# EAGLE board control (EAGLE 9.3.2), part 1 of 2
VERSION: v3.0
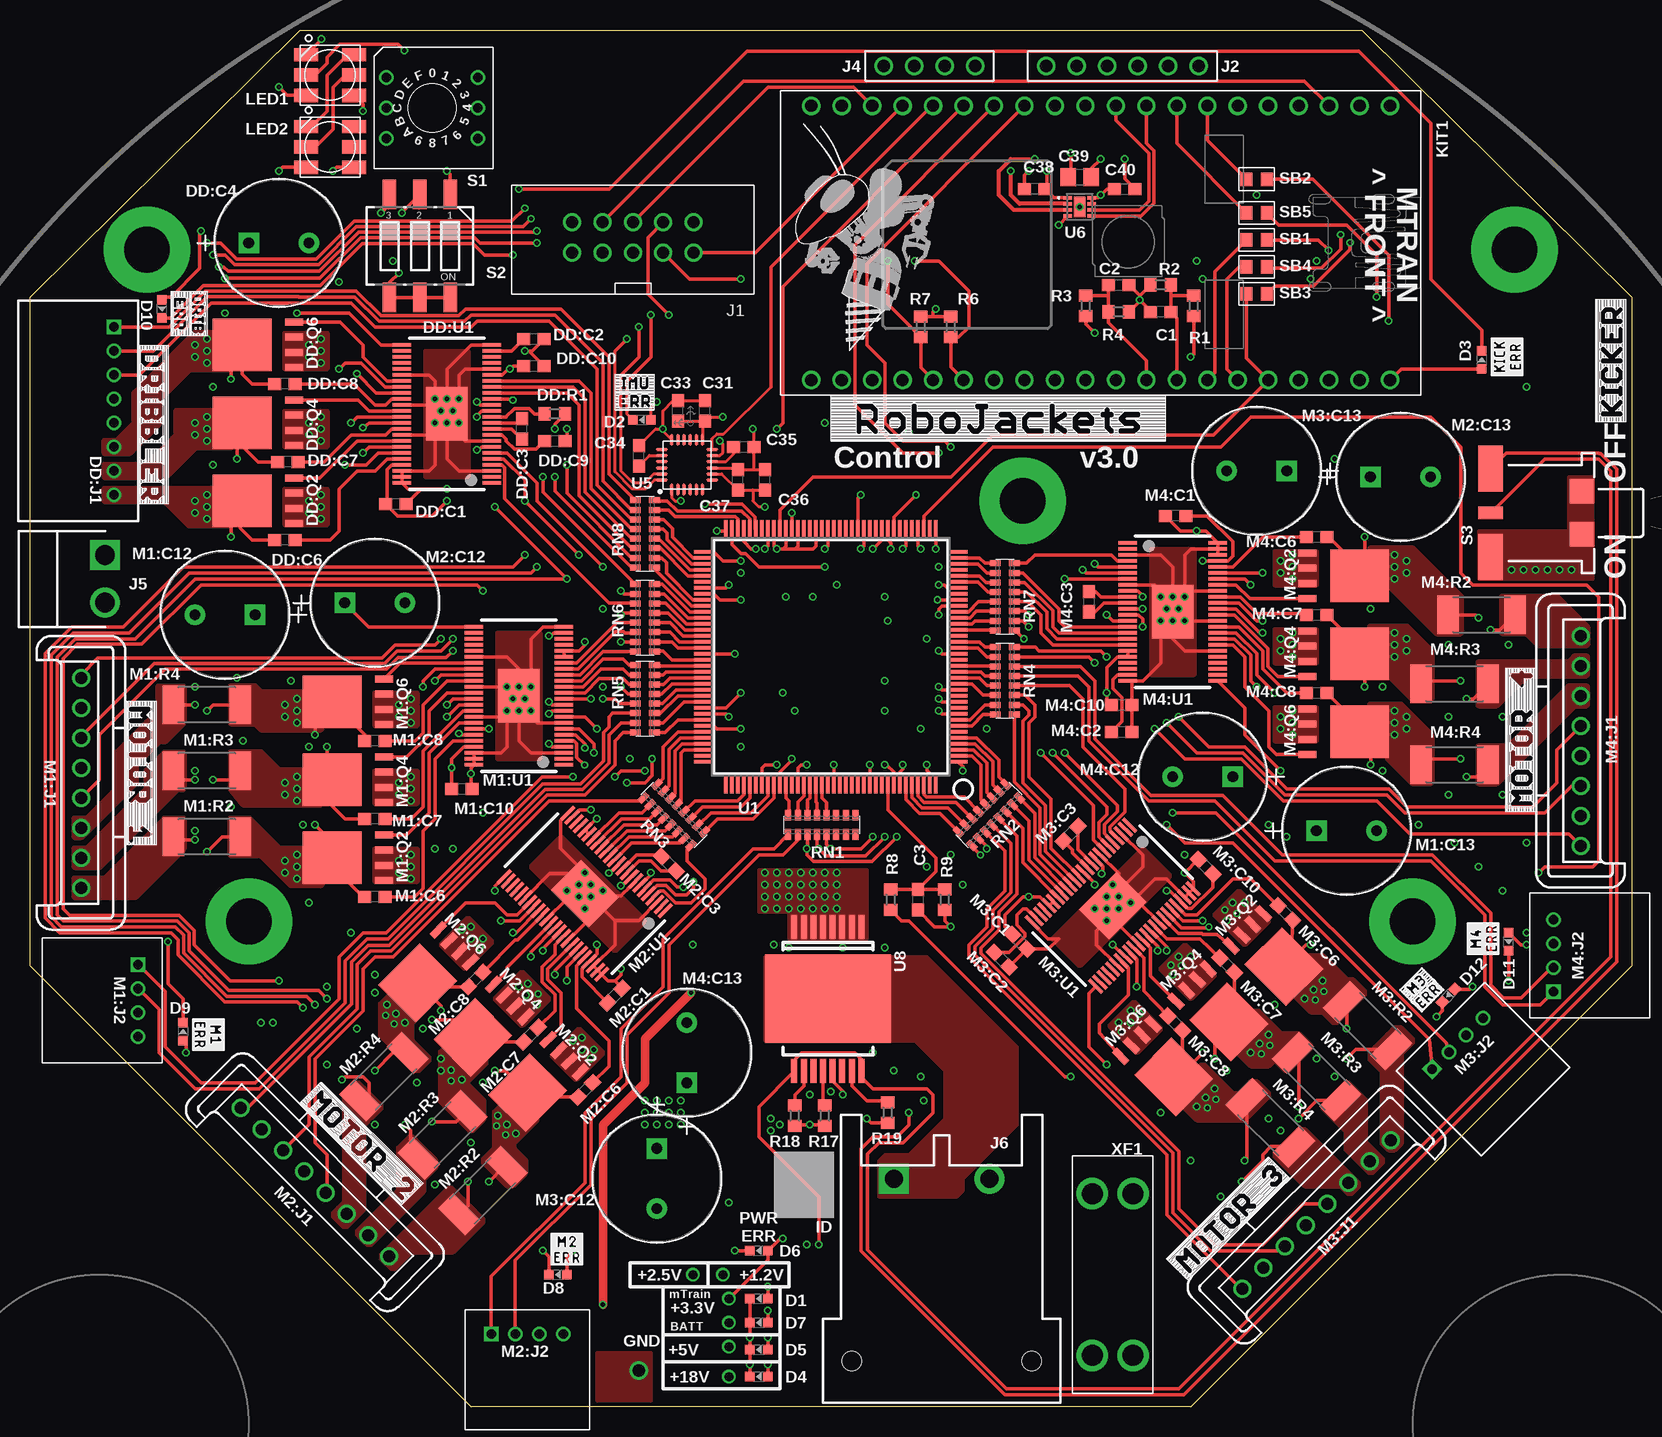
[diagram p8: board, top side]
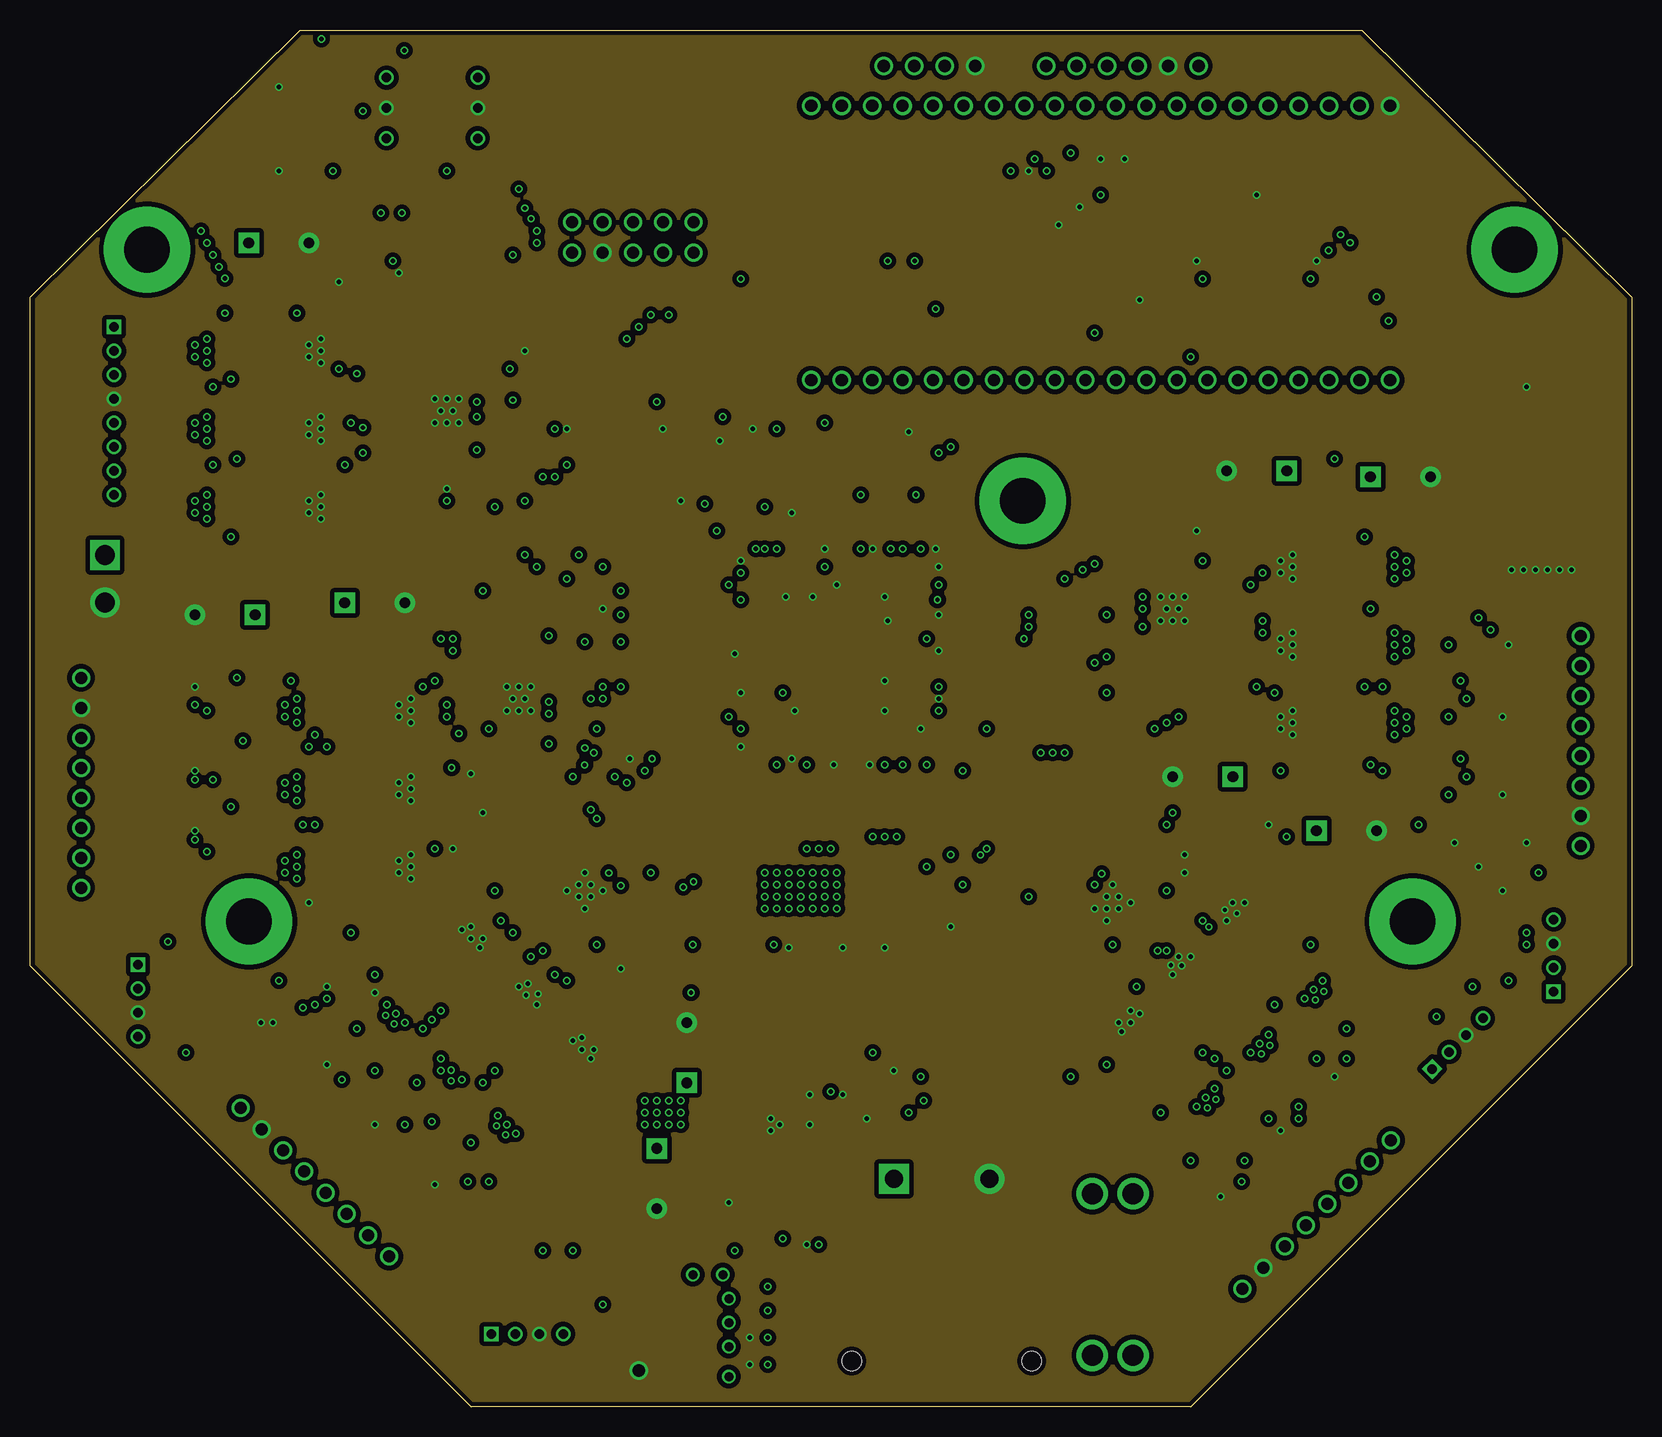
[diagram p9: board, inner layer GND]
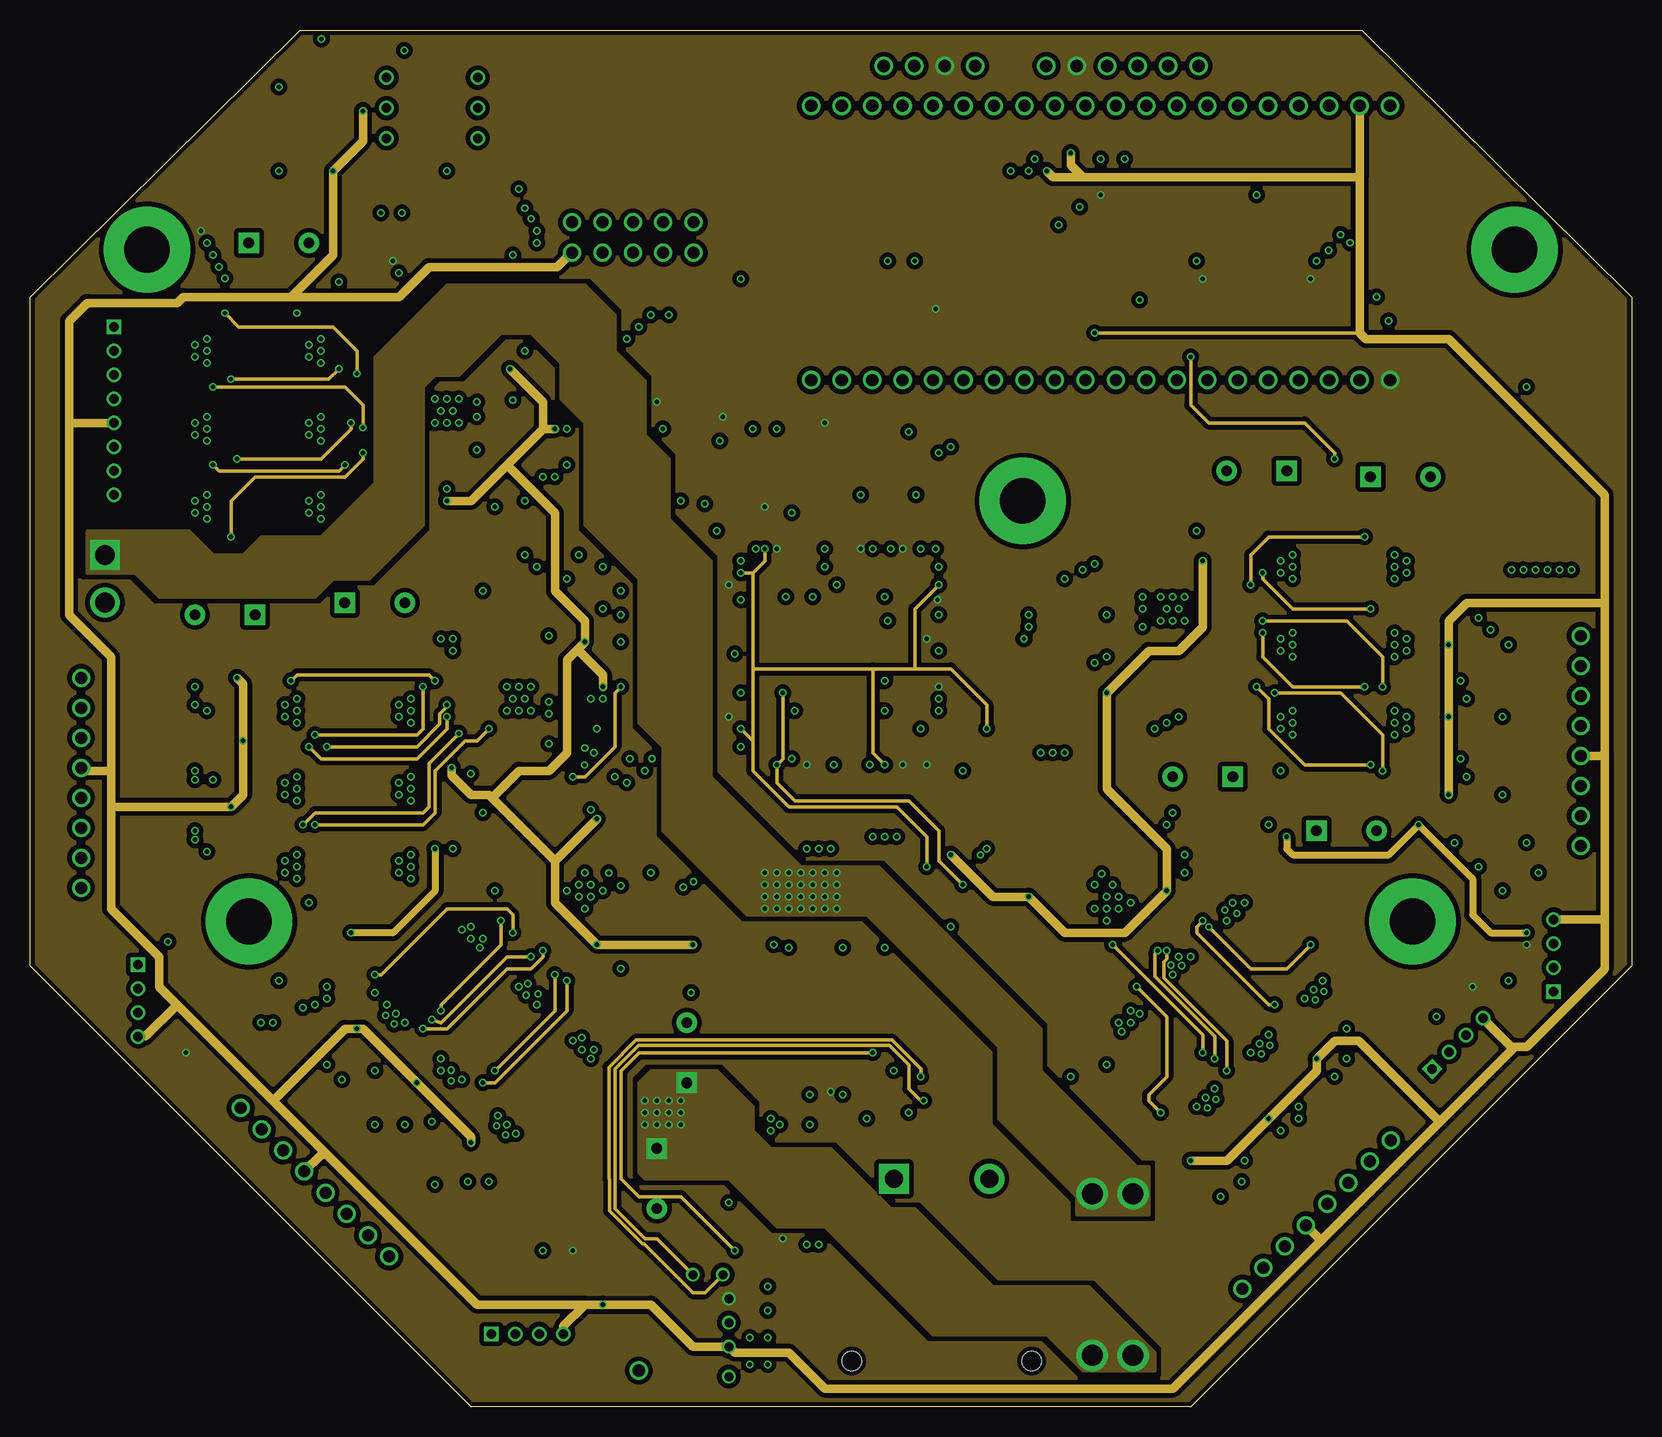
[diagram p10: board, inner layer Power]
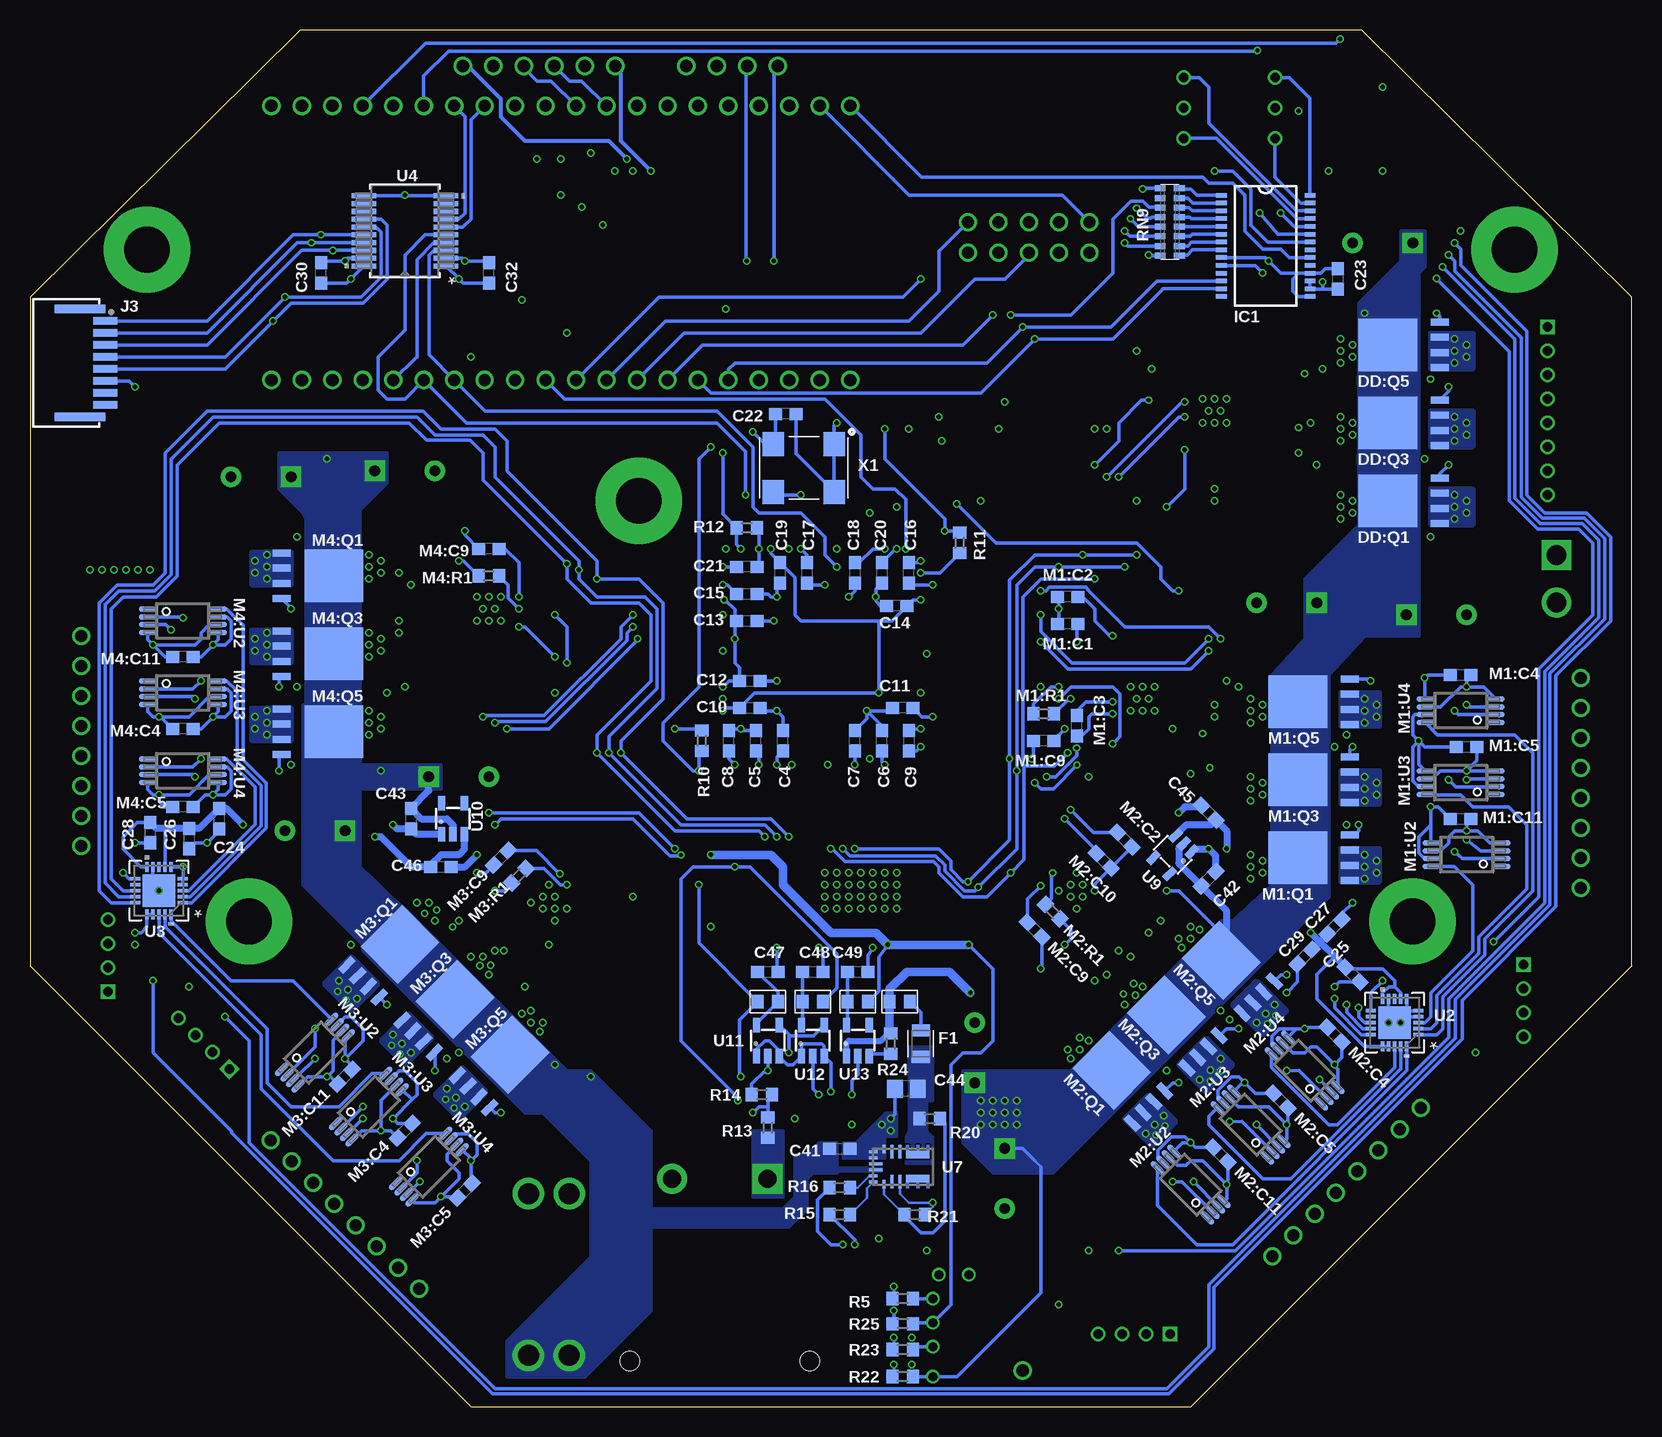
[diagram p11: board, bottom side, seen from below]

Size 133.5 x 114.75 mm. Coordinates in mm from the lower left corner, seen from the top.
Outline: 96.75,0 36.75,0 0,36.75 0,92.5 22.5,114.75 111,114.75 133.5,92.5 133.5,36.75 96.75,0
Copper layers (1+2*3+16): Top 0.018mm / dielectric 0.36mm / GND 0.035mm / dielectric 0.71mm / Power 0.035mm / dielectric 0.36mm / Bottom 0.018mm
Design rules "eC_4Layer_PClass6_BaseCopperO18-I35_eCDefault": minimum track width 0.15mm, minimum drill 0.35mm, track to track 0.15mm, track to pad 0.15mm, pad to pad 0.15mm, via to via 0.15mm, smd to smd 0mil, copper to edge 0.25mm, drill to drill 0.35mm, minimum pad ring 0.175mm, minimum via ring 0.125mm, stop-mask expansion 0mil, vias tented up to drill 0.45mm, thermal gap 0.2mm

## Footprints (pad centres in the part's own frame; a part is rotated, then mirrored left to right if it is on the bottom)
C0603 = smd 1.1 x 1: 1 -0.85,0; 2 0.85,0
C0805 = smd 1.3 x 1.5: 1 -0.95,0; 2 0.95,0
CHIP-LED0603 = smd 0.8 x 0.8: A 0,-0.75; C 0,0.75
CAP_PAN_10X12.5 = drill 0.914 pad 1.676 square: 1 -5.004,0 | drill 0.914 pad 1.676: 2 0,0
2MM-8-H = drill 0.8 square: 1 -7,0 | drill 0.8: 2 -5,0; 3 -3,0; 4 -1,0; 5 1,0; 6 3,0; 7 5,0; 8 7,0
PQFN_5X6_E = smd 1.5 x 0.6: 1 -3.02,1.905; 2 -3.02,0.635; 3 -3.02,-0.635; 4 -3.02,-1.905 | smd 4.895 x 4.41: 5678 1.323,0
R0603 = smd 1 x 1.1: 1 -0.85,0; 2 0.85,0
TSSOP-48_PAD = smd 0.3 x 1.55: 1 -5.75,-3.75; 2 -5.25,-3.75; 3 -4.75,-3.75; 4 -4.25,-3.75; 5 -3.75,-3.75; 6 -3.25,-3.75; 7 -2.75,-3.75; 8 -2.25,-3.75; 9 -1.75,-3.75; 10 -1.25,-3.75; 11 -0.75,-3.75; 12 -0.25,-3.75; 13 0.25,-3.75; 14 0.75,-3.75; 15 1.25,-3.75; 16 1.75,-3.75; 17 2.25,-3.75; 18 2.75,-3.75; 19 3.25,-3.75; 20 3.75,-3.75; 21 4.25,-3.75; 22 4.75,-3.75; 23 5.25,-3.75; 24 5.75,-3.75; 25 5.75,3.75; 26 5.25,3.75; 27 4.75,3.75; 28 4.25,3.75; 29 3.75,3.75; 30 3.25,3.75; 31 2.75,3.75; 32 2.25,3.75; 33 1.75,3.75; 34 1.25,3.75; 35 0.75,3.75; 36 0.25,3.75; 37 -0.25,3.75; 38 -0.75,3.75; 39 -1.25,3.75; 40 -1.75,3.75; 41 -2.25,3.75; 42 -2.75,3.75; 43 -3.25,3.75; 44 -3.75,3.75; 45 -4.25,3.75; 46 -4.75,3.75; 47 -5.25,3.75; 48 -5.75,3.75 | smd 4.42 x 3.483: PAD 0,0
FUSC2113X75 = smd 1 x 1.52: 1 -1.1,0 | smd 1 x 1.5: 2 1.1,0
SSOP-28 = smd 0.9 x 0.38: 1 -3.7,4.225; 2 -3.7,3.575; 3 -3.7,2.925; 4 -3.7,2.275; 5 -3.7,1.625; 6 -3.7,0.975; 7 -3.7,0.325; 8 -3.7,-0.325; 9 -3.7,-0.975; 10 -3.7,-1.625; 11 -3.7,-2.275; 12 -3.7,-2.925; 13 -3.7,-3.575; 14 -3.7,-4.225; 15 3.7,-4.225; 16 3.7,-3.575; 17 3.7,-2.925; 18 3.7,-2.275; 19 3.7,-1.625; 20 3.7,-0.975; 21 3.7,-0.325; 22 3.7,0.325; 23 3.7,0.975; 24 3.7,1.625; 25 3.7,2.275; 26 3.7,2.925; 27 3.7,3.575; 28 3.7,4.225
SBH11-*-D05-RA-VERT = drill 1: 1 -5.08,-1.27; 2 -2.54,-1.27; 3 0,-1.27; 4 2.54,-1.27; 5 5.08,-1.27; 6 5.08,1.27; 7 2.54,1.27; 8 0,1.27; 9 -2.54,1.27; 10 -5.08,1.27
6-PIN-HEADER = drill 1.02: 1 -2.54,0; 2 0,0; 3 2.54,0; 4 5.08,0; 5 7.62,0; 6 10.16,0
HFW8R-1ST = smd 0.6 x 2: 1 -3.5,3.25; 2 -2.5,3.25; 3 -1.5,3.25; 4 -0.5,3.25; 5 0.5,3.25; 6 1.5,3.25; 7 2.5,3.25; 8 3.5,3.25 | smd 0.7 x 4.2: LEG1 -4.5,1.15; LEG2 4.5,1.15
4-PIN-HEADER = drill 1.02: 1 -2.54,0; 2 0,0; 3 2.54,0; 4 5.08,0
B2PS-CENTERED = drill 1.65 square: 1 -1.98,0 | drill 1.65: 2 1.98,0
DF22-2-H = drill 1.5 pad 2.5 square: 1 3.96,0 | drill 1.5 pad 2.5: 2 -3.96,0 | hole 1.6: -7.5,15.2; 7.5,15.2
MTRAIN-KIT = drill 1.02: !RST 11.43,16.51; GND -11.43,24.13; NC 11.43,19.05; P$3 -11.43,19.05; P$4 -11.43,16.51; P$5 -11.43,13.97; P$6 -11.43,11.43; P$7 -11.43,8.89; P$8 -11.43,6.35; P$9 -11.43,3.81; P$10 -11.43,1.27; P$11 -11.43,-1.27; P$12 -11.43,-3.81; P$13 -11.43,-6.35; P$14 -11.43,-8.89; P$15 -11.43,-11.43; P$16 -11.43,-13.97; P$17 -11.43,-16.51; P$18 -11.43,-19.05; P$19 -11.43,-21.59; P$20 -11.43,-24.13; P$25 11.43,-13.97; P$26 11.43,-11.43; P$27 11.43,-8.89; P$28 11.43,-6.35; P$29 11.43,-3.81; P$30 11.43,-1.27; P$31 11.43,1.27; P$32 11.43,3.81; P$33 11.43,6.35; P$34 11.43,8.89; P$35 11.43,11.43; P$36 11.43,13.97; RX+ 11.43,-16.51; RX- 11.43,-19.05; TX+ 11.43,-21.59; TX- 11.43,-24.13; VBUS 11.43,21.59; VDD 11.43,24.13; VIN -11.43,21.59
APA102_5050 = smd 2 x 1.1: 1 2,-1.7; 2 2,0; 3 2,1.7; 4 -2,1.7; 5 -2,0; 6 -2,-1.7
MKS-1658 = drill 1 pad 1.422: 1 -8.75,0; 2 -6.25,0; 3 -3.75,0; 4 -1.25,0; 5 1.25,0; 6 3.75,0; 7 6.25,0; 8 8.75,0
2MM-4-H = drill 0.8 square: 1 -3,0 | drill 0.8: 2 -1,0; 3 1,0; 4 3,0
R2512 = smd 1.8 x 3.2: 1 -2.8,0; 2 2.8,0
PW0008A_N = smd 1.4 x 0.45: 1 -2.95,0.975; 2 -2.95,0.325; 3 -2.95,-0.325; 4 -2.95,-0.975; 5 2.95,-0.975; 6 2.95,-0.325; 7 2.95,0.325; 8 2.95,0.975
RA-8_2506 = smd 0.5 x 0.9: 1 -2.8,-0.8; 2 -2,-0.8; 3 -1.2,-0.8; 4 -0.4,-0.8; 5 0.4,-0.8; 6 1.2,-0.8; 7 2,-0.8; 8 2.8,-0.8; 9 2.8,0.8; 10 2,0.8; 11 1.2,0.8; 12 0.4,0.8; 13 -0.4,0.8; 14 -1.2,0.8; 15 -2,0.8; 16 -2.8,0.8
HEX = drill 0.8: 1 -2.54,-2.54; 2 2.54,5.08; 4 2.54,-2.54; 8 -2.54,5.08; C1 0,-2.54; C2 0,5.08
CTS-219-03 = smd 1.13 x 2.44: 1 -2.54,-4.3; 2 0,-4.3; 3 2.54,-4.3; 4 2.54,4.3; 5 0,4.3; 6 -2.54,4.3
34EWMSP12M6RT = smd 3.81 x 2.03: 1 -3.685,0; 3 3.685,0 | smd 1.02 x 2.03: 2 0,0 | smd 2.03 x 2.03: LEG1 -1.78,7.62; LEG3 1.78,7.62
SB0603 = smd 1 x 1.1: 1 -0.85,0; 2 0.85,0
TQFP144 = smd 0.3 x 1.6: 1 -8.75,-10.6; 2 -8.25,-10.6; 3 -7.75,-10.6; 4 -7.25,-10.6; 5 -6.75,-10.6; 6 -6.25,-10.6; 7 -5.75,-10.6; 8 -5.25,-10.6; 9 -4.75,-10.6; 10 -4.25,-10.6; 11 -3.75,-10.6; 12 -3.25,-10.6; 13 -2.75,-10.6; 14 -2.25,-10.6; 15 -1.75,-10.6; 16 -1.25,-10.6; 17 -0.75,-10.6; 18 -0.25,-10.6; 19 0.25,-10.6; 20 0.75,-10.6; 21 1.25,-10.6; 22 1.75,-10.6; 23 2.25,-10.6; 24 2.75,-10.6; 25 3.25,-10.6; 26 3.75,-10.6; 27 4.25,-10.6; 28 4.75,-10.6; 29 5.25,-10.6; 30 5.75,-10.6; 31 6.25,-10.6; 32 6.75,-10.6; 33 7.25,-10.6; 34 7.75,-10.6; 35 8.25,-10.6; 36 8.75,-10.6; 73 8.75,10.6; 74 8.25,10.6; 75 7.75,10.6; 76 7.25,10.6; 77 6.75,10.6; 78 6.25,10.6; 79 5.75,10.6; 80 5.25,10.6; 81 4.75,10.6; 82 4.25,10.6; 83 3.75,10.6; 84 3.25,10.6; 85 2.75,10.6; 86 2.25,10.6; 87 1.75,10.6; 88 1.25,10.6; 89 0.75,10.6; 90 0.25,10.6; 91 -0.25,10.6; 92 -0.75,10.6; 93 -1.25,10.6; 94 -1.75,10.6; 95 -2.25,10.6; 96 -2.75,10.6; 97 -3.25,10.6; 98 -3.75,10.6; 99 -4.25,10.6; 100 -4.75,10.6; 101 -5.25,10.6; 102 -5.75,10.6; 103 -6.25,10.6; 104 -6.75,10.6; 105 -7.25,10.6; 106 -7.75,10.6; 107 -8.25,10.6; 108 -8.75,10.6 | smd 1.6 x 0.3: 37 10.6,-8.75; 38 10.6,-8.25; 39 10.6,-7.75; 40 10.6,-7.25; 41 10.6,-6.75; 42 10.6,-6.25; 43 10.6,-5.75; 44 10.6,-5.25; 45 10.6,-4.75; 46 10.6,-4.25; 47 10.6,-3.75; 48 10.6,-3.25; 49 10.6,-2.75; 50 10.6,-2.25; 51 10.6,-1.75; 52 10.6,-1.25; 53 10.6,-0.75; 54 10.6,-0.25; 55 10.6,0.25; 56 10.6,0.75; 57 10.6,1.25; 58 10.6,1.75; 59 10.6,2.25; 60 10.6,2.75; 61 10.6,3.25; 62 10.6,3.75; 63 10.6,4.25; 64 10.6,4.75; 65 10.6,5.25; 66 10.6,5.75; 67 10.6,6.25; 68 10.6,6.75; 69 10.6,7.25; 70 10.6,7.75; 71 10.6,8.25; 72 10.6,8.75; 109 -10.6,8.75; 110 -10.6,8.25; 111 -10.6,7.75; 112 -10.6,7.25; 113 -10.6,6.75; 114 -10.6,6.25; 115 -10.6,5.75; 116 -10.6,5.25; 117 -10.6,4.75; 118 -10.6,4.25; 119 -10.6,3.75; 120 -10.6,3.25; 121 -10.6,2.75; 122 -10.6,2.25; 123 -10.6,1.75; 124 -10.6,1.25; 125 -10.6,0.75; 126 -10.6,0.25; 127 -10.6,-0.25; 128 -10.6,-0.75; 129 -10.6,-1.25; 130 -10.6,-1.75; 131 -10.6,-2.25; 132 -10.6,-2.75; 133 -10.6,-3.25; 134 -10.6,-3.75; 135 -10.6,-4.25; 136 -10.6,-4.75; 137 -10.6,-5.25; 138 -10.6,-5.75; 139 -10.6,-6.25; 140 -10.6,-6.75; 141 -10.6,-7.25; 142 -10.6,-7.75; 143 -10.6,-8.25; 144 -10.6,-8.75
RTJ20_2P7X2P7 = smd 0.85 x 0.28: 1 -1.975,1; 2 -1.975,0.5; 3 -1.975,0; 4 -1.975,-0.5; 5 -1.975,-1; 11 1.975,-1; 12 1.975,-0.5; 13 1.975,0; 14 1.975,0.5; 15 1.975,1 | smd 0.28 x 0.85: 6 -1,-1.975; 7 -0.5,-1.975; 8 0,-1.975; 9 0.5,-1.975; 10 1,-1.975; 16 1,1.975; 17 0.5,1.975; 18 0,1.975; 19 -0.5,1.975; 20 -1,1.975 | smd 2.7 x 2.7: 21 0,0
RS_20 = smd 2.057 x 0.432: 1 -3.429,2.925; 2 -3.429,2.275; 3 -3.429,1.625; 4 -3.429,0.975; 5 -3.429,0.325; 6 -3.429,-0.325; 7 -3.429,-0.975; 8 -3.429,-1.625; 9 -3.429,-2.275; 10 -3.429,-2.925; 11 3.429,-2.925; 12 3.429,-2.275; 13 3.429,-1.625; 14 3.429,-0.975; 15 3.429,-0.325; 16 3.429,0.325; 17 3.429,0.975; 18 3.429,1.625; 19 3.429,2.275; 20 3.429,2.925
QFN-24-4MM2 = smd 1.016 x 0.254: 1 -2.066,1.257; 2 -2.066,0.75; 3 -2.066,0.247; 4 -2.066,-0.287; 5 -2.066,-0.792; 6 -2.066,-1.297; 13 2.086,-1.297; 14 2.086,-0.792; 15 2.086,-0.287; 16 2.086,0.247; 17 2.086,0.75; 18 2.086,1.257 | smd 0.254 x 1.016: 7 -1.267,-2.122; 8 -0.762,-2.122; 9 -0.258,-2.122; 10 0.278,-2.122; 11 0.78,-2.122; 12 1.287,-2.122; 19 1.287,2.082; 20 0.78,2.082; 21 0.278,2.082; 22 -0.258,2.082; 23 -0.762,2.082; 24 -1.267,2.082
DSG_8 = smd 0.711 x 0.305: 1 -1.003,0.762; 2 -1.003,0.254; 3 -1.003,-0.254; 4 -1.003,-0.762; 5 1.003,-0.762; 6 1.003,-0.254; 7 1.003,0.254; 8 1.003,0.762 | smd 0.965 x 1.702: 9 0,0
MPM3620GQV-P = smd 0.7 x 0.25: 1 -1.45,1.55; 12 1.45,1.55 | smd 1.1 x 0.25: 2 -1.25,0.9; 3 -1.25,0.25; 10 1.25,0.25; 11 1.25,0.9 | smd 0.25 x 0.7: 13 1.25,2.45; 14 0.75,2.45; 17 -0.75,2.45; 18 -1.25,2.45 | smd 0.25 x 1.1: 15 0.25,2.25; 16 -0.25,2.25 | smd 0.6 x 1.95: 456 -1,-1.25; 789 1,-1.25
POWERSO-16 = smd 0.5 x 2: 1 -2.8,-6; 2 -2,-6; 3 -1.2,-6; 4 -0.4,-6; 5 0.4,-6; 6 1.2,-6; 7 2,-6; 8 2.8,-6; 9 2.8,6; 10 2,6; 11 1.2,6; 12 0.4,6; 13 -0.4,6; 14 -1.2,6; 15 -2,6; 16 -2.8,6 | smd 10.5 x 7.4: 17 0,0
SOT-23-5 = smd 0.6 x 1.2: 1 -0.95,-1.306; 2 0,-1.306; 3 0.95,-1.306; 4 0.95,1.306; 5 -0.95,1.306
ASV = smd 1.8 x 2: 1 -2.54,-2; 2 2.54,-2; 3 2.54,2; 4 -2.54,2
3557-2 = drill 1.75: 1 -6.735,1.7; 2 -6.735,-1.7; 3 6.735,-1.7; 4 6.735,1.7

## Placement (x,y rotation side)
C1  0.1uF 50V  [C0603]  94.25,91.25 180 top
C2  0.1uF  [C0603]  90.75,93.5 0 top
C3  0.1uF  [C0603]  74,42.25 270 top
C4  0.1uF  [C0603]  70.75,55.5 90 bottom
C5  0.1uF  [C0603]  73,55.5 90 bottom
C6  0.1uF  [C0603]  62.5,55.5 90 bottom
C7  0.1uF  [C0603]  64.75,55.5 90 bottom
C8  0.1uF  [C0603]  75.25,55.5 90 bottom
C9  0.1uF  [C0603]  60.25,55.5 270 bottom
C10  0.1uF  [C0603]  73.5,58.25 0 bottom
C11  0.1uF  [C0603]  60.75,58.25 180 bottom
C12  0.1uF  [C0603]  73.5,60.5 0 bottom
C13  0.1uF  [C0603]  73.75,65.5 0 bottom
C14  0.1uF  [C0603]  61.25,66.75 180 bottom
C15  0.1uF  [C0603]  73.75,67.75 0 bottom
C16  0.1uF  [C0603]  60.25,69.5 90 bottom
C17  0.1uF  [C0603]  68.75,69.5 270 bottom
C18  0.1uF  [C0603]  64.75,69.5 270 bottom
C19  0.1uF  [C0603]  71,69.5 270 bottom
C20  0.1uF  [C0603]  62.5,69.5 270 bottom
C21  0.1uF  [C0603]  73.75,70 180 bottom
C22  0.1uF  [C0603]  70.5,82.75 180 bottom
C23  0.1uF  [C0603]  24.5,94 270 bottom
C24  10uF  [C0603]  117.75,49 270 bottom
C25  10uF  [C0603]  23.25,36 315 bottom
C26  0.1uF  [C0603]  120.25,47.35 270 bottom
C27  0.1uF  [C0603]  24.75,40 45 bottom
C28  0.1uF  [C0603]  123.5,47.85 270 bottom
C29  0.1uF  [C0603]  27.25,37.5 225 bottom
C30  0.1uF  [C0603]  109.25,94.5 90 bottom
C31  0.47uF  [C0603]  56.25,83 90 top
C32  0.1uF  [C0603]  95.25,94.5 90 bottom
C33  0.47uF  [C0603]  54,83 90 top
C34  2200pF  [C0603]  50.75,79.25 90 top
C35  0.1uF  [C0603]  59.5,80 0 top
C36  10000pF  [C0603]  61.25,77.25 90 top
C37  0.47uF  [C0603]  59,77.25 90 top
C38  0.1uF  [C0603]  83.75,101.5 180 top
C39  10uF  [C0805]  87.5,102.5 0 top
C40  0.1uF  [C0603]  91.25,101.5 0 top
C41  GRM188R6YA106MA73D  [C0603]  66,21.5 0 bottom
C42  0.1uF 50V  [C0603]  35.25,44 45 bottom
C43  0.1uF 50V  [C0603]  101.75,49 270 bottom
C44  22uF 16V  [C0805]  60.45,26.5 180 bottom
C45  1uF  [C0603]  35.25,49.5 135 bottom
C46  1uF  [C0603]  99.25,45 0 bottom
C47  1uF  [C0603]  72,36.25 0 bottom
C48  1uF  [C0603]  68.25,36.25 0 bottom
C49  1uF  [C0603]  64.5,36.25 0 bottom
D1  GREEN  [CHIP-LED0603]  60.75,9 90 top
D2  RED  [CHIP-LED0603]  51,82.25 90 top
D3  RED  [CHIP-LED0603]  121,87.25 0 top
D4  GREEN  [CHIP-LED0603]  60.75,2.5 90 top
D5  GREEN  [CHIP-LED0603]  60.75,4.75 90 top
D6  RED  [CHIP-LED0603]  60.75,13 90 top
D7  GREEN  [CHIP-LED0603]  60.75,7 90 top
D8  RED  [CHIP-LED0603]  44,11 90 top
D9  RED  [CHIP-LED0603]  12.75,31.25 0 top
D10  RED  [CHIP-LED0603]  11,91.5 180 top
D11  RED  [CHIP-LED0603]  123.25,38.75 180 top
D12  RED  [CHIP-LED0603]  118.25,34.25 136 top
DD:C1  1uF  [C0603]  30.5,75.25 0 top
DD:C2  1uF  [C0603]  42,89 0 top
DD:C3  0.022uF 50V  [C0603]  41,81.5 90 top
DD:C4  ECA-1HHG221  [CAP_PAN_10X12.5]  23.25,97 0 top
DD:C6  0.1uF 50V  [C0603]  21.25,72.25 180 top
DD:C7  0.1uF 50V  [C0603]  21.5,78.75 180 top
DD:C8  0.1uF 50V  [C0603]  21.25,85.25 180 top
DD:C9  2.2uF 50V  [C0603]  43.75,80.5 0 top
DD:C10  0.1uF 50V  [C0603]  42,86.75 0 top
DD:J1  8-PIN_2MM-H  [2MM-8-H]  7,83 270 top
DD:Q1  IRFH7545  [PQFN_5X6_E]  19,75.5 180 bottom
DD:Q2  IRFH7545  [PQFN_5X6_E]  19,75.5 180 top
DD:Q3  IRFH7545  [PQFN_5X6_E]  19,82 180 bottom
DD:Q4  IRFH7545  [PQFN_5X6_E]  19,82 180 top
DD:Q5  IRFH7545  [PQFN_5X6_E]  19,88.5 180 bottom
DD:Q6  IRFH7545  [PQFN_5X6_E]  19,88.5 180 top
DD:R1  10k  [R0603]  43.75,82.75 180 top
DD:U1  DRV8303DCA  [TSSOP-48_PAD]  34.75,82.75 90 top
F1  0805L200SLTHYR  [FUSC2113X75]  59.25,30.25 90 bottom
IC1  MCP23017-E/SS  [SSOP-28]  30.5,96.75 0 bottom
J1  SBH11-PBPC-D05-ST-BK  [SBH11-*-D05-RA-VERT]  50.25,97.44 180 top
J2  6-PIN-HEADER  [6-PIN-HEADER]  87.25,111.75 0 top
J3  HFW8R-1ST  [HFW8R-1ST]  130.5,87 270 bottom
J4  4-PIN-HEADER  [4-PIN-HEADER]  76.25,111.75 180 top
J5  B2PS-VH(LF)(SN)  [B2PS-CENTERED]  6.25,69 270 top
J6  DF22-2  [DF22-2-H]  76,19 180 top
KIT1  MTRAIN  [MTRAIN-KIT]  89.25,97 270 top
LED1  APA102C-5050  [APA102_5050]  25,111 0 top
LED2  APA102C-5050  [APA102_5050]  25,105 0 top
M1:C1  1uF  [C0603]  47,65.25 180 bottom
M1:C2  1uF  [C0603]  47,67.5 180 bottom
M1:C3  0.022uF 50V  [C0603]  46.25,56.75 90 bottom
M1:C4  0.1uF  [C0603]  14.25,61 0 bottom
M1:C5  0.1uF  [C0603]  13.75,55 0 bottom
M1:C6  0.1uF 50V  [C0603]  28.75,42.5 180 top
M1:C7  0.1uF 50V  [C0603]  28.75,49 180 top
M1:C8  0.1uF 50V  [C0603]  28.75,55.5 180 top
M1:C9  2.2uF 50V  [C0603]  49,55.5 180 bottom
M1:C10  0.1uF 50V  [C0603]  36,51.5 0 top
M1:C11  0.1uF  [C0603]  14.25,49 0 bottom
M1:C12  ECA-1HHG221  [CAP_PAN_10X12.5]  13.75,66 180 top
M1:C13  ECA-1HHG221  [CAP_PAN_10X12.5]  112.25,48 0 top
M1:J1  MKS-1658  [MKS-1658]  4.25,52 270 top
M1:J2  4-PIN_2MM-H  [2MM-4-H]  9,33.85 270 top
M1:Q1  IRFH7545  [PQFN_5X6_E]  26.5,45.75 180 bottom
M1:Q2  IRFH7545  [PQFN_5X6_E]  26.5,45.75 180 top
M1:Q3  IRFH7545  [PQFN_5X6_E]  26.5,52.25 180 bottom
M1:Q4  IRFH7545  [PQFN_5X6_E]  26.5,52.25 180 top
M1:Q5  IRFH7545  [PQFN_5X6_E]  26.5,58.75 180 bottom
M1:Q6  IRFH7545  [PQFN_5X6_E]  26.5,58.75 180 top
M1:R1  10k  [R0603]  49,57.75 0 bottom
M1:R2  0.001 1%  [R2512]  14.75,47.5 180 top
M1:R3  0.001 1%  [R2512]  14.75,53 180 top
M1:R4  0.001 1%  [R2512]  14.75,58.5 180 top
M1:U1  DRV8303DCA  [TSSOP-48_PAD]  40.75,59.25 90 top
M1:U2  INA240PWR  [PW0008A_N]  13.75,46 180 bottom
M1:U3  INA240PWR  [PW0008A_N]  14.25,52 180 bottom
M1:U4  INA240PWR  [PW0008A_N]  14.25,58 180 bottom
M2:C1  1uF  [C0603]  48.75,34.25 45 top
M2:C2  1uF  [C0603]  42.25,47.25 315 bottom
M2:C3  0.022uF 50V  [C0603]  53.25,45.25 135 top
M2:C4  0.1uF  [C0603]  24.75,31 315 bottom
M2:C5  0.1uF  [C0603]  29.25,25.5 315 bottom
M2:C6  0.1uF 50V  [C0603]  46.3,26.4 225 top
M2:C7  0.1uF 50V  [C0603]  41.75,31 225 top
M2:C8  0.1uF 50V  [C0603]  37.15,35.6 225 top
M2:C9  2.2uF 50V  [C0603]  49.75,39.75 315 bottom
M2:C10  0.1uF 50V  [C0603]  44,45.5 315 bottom
M2:C11  0.1uF  [C0603]  34.25,21 315 bottom
M2:C12  ECA-1HHG221  [CAP_PAN_10X12.5]  31.25,67 0 top
M2:C13  ECA-1HHG221  [CAP_PAN_10X12.5]  116.75,77.5 0 top
M2:J1  MKS-1658  [MKS-1658]  23.75,18.7 315 top
M2:J2  4-PIN_2MM-H  [2MM-4-H]  41.45,6.05 0 top
M2:Q1  IRFH7545  [PQFN_5X6_E]  42.4,27.1 135 bottom
M2:Q2  IRFH7545  [PQFN_5X6_E]  42.4,27.1 225 top
M2:Q3  IRFH7545  [PQFN_5X6_E]  37.85,31.7 135 bottom
M2:Q4  IRFH7545  [PQFN_5X6_E]  37.85,31.7 225 top
M2:Q5  IRFH7545  [PQFN_5X6_E]  33.25,36.25 135 bottom
M2:Q6  IRFH7545  [PQFN_5X6_E]  33.25,36.25 225 top
M2:R1  10k  [R0603]  48.25,41.25 135 bottom
M2:R2  0.001 1%  [R2512]  37.75,18 225 top
M2:R3  0.001 1%  [R2512]  34.4,22.65 225 top
M2:R4  0.001 1%  [R2512]  29.5,27.5 225 top
M2:U1  DRV8303DCA  [TSSOP-48_PAD]  46.25,42.75 135 top
M2:U2  INA240PWR  [PW0008A_N]  36.75,18.5 135 bottom
M2:U3  INA240PWR  [PW0008A_N]  31.75,23.5 135 bottom
M2:U4  INA240PWR  [PW0008A_N]  27.25,28 135 bottom
M3:C1  1uF  [C0603]  82.5,38.75 315 top
M3:C2  1uF  [C0603]  81,37.25 315 top
M3:C3  0.022uF 50V  [C0603]  86.75,47.75 225 top
M3:C4  0.1uF  [C0603]  102.25,23 225 bottom
M3:C5  0.1uF  [C0603]  97.25,18 225 bottom
M3:C6  0.1uF 50V  [C0603]  104.65,41.15 315 top
M3:C7  0.1uF 50V  [C0603]  99.8,36.8 315 top
M3:C8  0.1uF 50V  [C0603]  95.45,31.95 315 top
M3:C9  2.2uF 50V  [C0603]  94.25,45.75 225 bottom
M3:C10  0.1uF 50V  [C0603]  98,45 135 top
M3:C11  0.1uF  [C0603]  107.25,27.5 225 bottom
M3:C12  ECA-1HHG221  [CAP_PAN_10X12.5]  52.25,16.5 270 top
M3:C13  ECA-1HHG221  [CAP_PAN_10X12.5]  99.75,78 180 top
M3:J1  MKS-1658  [MKS-1658]  107.25,16 45 top
M3:J2  4-PIN_2MM-H  [2MM-4-H]  119,30.25 45 top
M3:Q1  IRFH7545  [PQFN_5X6_E]  103.6,37.6 45 bottom
M3:Q2  IRFH7545  [PQFN_5X6_E]  103.6,37.6 315 top
M3:Q3  IRFH7545  [PQFN_5X6_E]  99,33 45 bottom
M3:Q4  IRFH7545  [PQFN_5X6_E]  99,33 315 top
M3:Q5  IRFH7545  [PQFN_5X6_E]  94.4,28.4 45 bottom
M3:Q6  IRFH7545  [PQFN_5X6_E]  94.4,28.4 315 top
M3:R1  10k  [R0603]  92.75,44.25 45 bottom
M3:R2  0.001 1%  [R2512]  111.5,31.75 315 top
M3:R3  0.001 1%  [R2512]  107.25,27.5 315 top
M3:R4  0.001 1%  [R2512]  103.4,23.65 315 top
M3:U1  DRV8303DCA  [TSSOP-48_PAD]  90.25,41.75 225 top
M3:U2  INA240PWR  [PW0008A_N]  109.75,29.5 45 bottom
M3:U3  INA240PWR  [PW0008A_N]  105.25,25 45 bottom
M3:U4  INA240PWR  [PW0008A_N]  100.25,20 45 bottom
M4:C1  1uF  [C0603]  95.5,74.25 180 top
M4:C2  1uF  [C0603]  91,56.25 0 top
M4:C3  0.022uF 50V  [C0603]  88.25,67.1 270 top
M4:C4  0.1uF  [C0603]  120.75,56.5 180 bottom
M4:C5  0.1uF  [C0603]  120.75,50 180 bottom
M4:C6  0.1uF 50V  [C0603]  107.25,72.5 0 top
M4:C7  0.1uF 50V  [C0603]  107.25,66 0 top
M4:C8  0.1uF 50V  [C0603]  107.25,59.5 0 top
M4:C9  2.2uF 50V  [C0603]  95.25,71.5 180 bottom
M4:C10  0.1uF 50V  [C0603]  91,58.5 0 top
M4:C11  0.1uF  [C0603]  120.75,62.5 180 bottom
M4:C12  ECA-1HHG221  [CAP_PAN_10X12.5]  95.25,52.5 180 top
M4:C13  ECA-1HHG221  [CAP_PAN_10X12.5]  54.75,32 90 top
M4:J1  MKS-1658  [MKS-1658]  129.25,55.5 90 top
M4:J2  4-PIN_2MM-H  [2MM-4-H]  127,37.6 90 top
M4:Q1  IRFH7545  [PQFN_5X6_E]  109.5,69.25 0 bottom
M4:Q2  IRFH7545  [PQFN_5X6_E]  109.5,69.25 0 top
M4:Q3  IRFH7545  [PQFN_5X6_E]  109.5,62.75 0 bottom
M4:Q4  IRFH7545  [PQFN_5X6_E]  109.5,62.75 0 top
M4:Q5  IRFH7545  [PQFN_5X6_E]  109.5,56.25 0 bottom
M4:Q6  IRFH7545  [PQFN_5X6_E]  109.5,56.25 0 top
M4:R1  10k  [R0603]  95.25,69.25 0 bottom
M4:R2  0.001 1%  [R2512]  121,66 0 top
M4:R3  0.001 1%  [R2512]  118.75,60.25 0 top
M4:R4  0.001 1%  [R2512]  118.75,53.5 0 top
M4:U1  DRV8303DCA  [TSSOP-48_PAD]  95.25,66.25 270 top
M4:U2  INA240PWR  [PW0008A_N]  120.75,65.5 0 bottom
M4:U3  INA240PWR  [PW0008A_N]  120.75,59.5 0 bottom
M4:U4  INA240PWR  [PW0008A_N]  120.75,53 0 bottom
R1  68k  [R0603]  97,91.75 90 top
R2  10k  [R0603]  94.25,93.5 180 top
R3  10k  [R0603]  88,91.75 90 top
R4  10k  [R0603]  90.75,91.25 0 top
R5  330  [R0603]  60.75,9 180 bottom
R6  4.7k  [R0603]  76.75,90 90 top
R7  4.7k  [R0603]  74.25,90 90 top
R8  68k  [R0603]  71.75,42.25 90 top
R9  10k  [R0603]  76.25,42.25 270 top
R10  4.7k  [R0603]  77.5,55.5 90 bottom
R11  330  [R0603]  56,72 270 bottom
R12  4.7k  [R0603]  73.75,73.25 180 bottom
R13  270k  [R0603]  72,23.25 270 bottom
R14  100k  [R0603]  72.5,26 0 bottom
R15  43.2k  [R0603]  66,16 0 bottom
R16  150k  [R0603]  66,18.25 0 bottom
R17  10k  [R0603]  66.25,24.25 90 top
R18  1k  [R0603]  63.75,24.25 90 top
R19  1k  [R0603]  71.5,24.5 90 top
R20  160k 1%  [R0603]  58.5,24 180 bottom
R21  30.1k 1%  [R0603]  59.75,16 180 bottom
R22  1k  [R0603]  60.75,2.5 0 bottom
R23  1k  [R0603]  60.75,4.75 180 bottom
R24  10k  [R0603]  61.75,30.25 90 bottom
R25  330  [R0603]  60.75,6.9 0 bottom
RN1  330  [RA-8_2506]  66,48.5 180 top
RN2  330  [RA-8_2506]  79.93,49.32 225 top
RN3  330  [RA-8_2506]  53.68,49.32 135 top
RN4  330  [RA-8_2506]  81.25,60.5 270 top
RN5  330  [RA-8_2506]  51.25,59 90 top
RN6  330  [RA-8_2506]  51.25,65.75 90 top
RN7  330  [RA-8_2506]  81.25,67.5 270 top
RN8  330  [RA-8_2506]  51.25,72.75 90 top
RN9  330  [RA-8_2506]  38.5,98.75 90 bottom
S1  94HCB16T  [HEX]  32.25,108.25 270 top
S2  219-03  [CTS-219-03]  32.5,96.75 180 top
S3  34EWMSP12M6RT  [34EWMSP12M6RT]  121.75,74.5 270 top
SB1  SOLDERBRIDGESB0603  [SB0603]  102.25,97.25 0 top
SB2  SOLDERBRIDGESB0603  [SB0603]  102.25,102.3 0 top
SB3  SOLDERBRIDGESB0603  [SB0603]  102.25,92.75 0 top
SB4  SOLDERBRIDGESB0603  [SB0603]  102.25,95 0 top
SB5  SOLDERBRIDGESB0603  [SB0603]  102.25,99.5 0 top
SB6  SOLDERBRIDGESB0603  [SB0603]  61,33.75 180 bottom
SB7  SOLDERBRIDGESB0603  [SB0603]  72,33.75 180 bottom
SB8  SOLDERBRIDGESB0603  [SB0603]  68.25,33.75 0 bottom
SB9  SOLDERBRIDGESB0603  [SB0603]  64.5,33.75 0 bottom
U1  XC3S250E-4TQG144C  [TQFP144]  66.75,62.5 90 top
U2  ADS8028IRTJT  [RTJ20_2P7X2P7]  19.75,32 180 bottom
U3  ADS8028IRTJT  [RTJ20_2P7X2P7]  122.75,43 180 bottom
U4  ADUM3151ARSZ  [RS_20]  102.25,98 180 bottom
U5  MPU-6050  [QFN-24-4MM2]  54.75,78.5 90 top
U6  DRV8837X  [DSG_8]  87.5,100 0 top
U7  MPM3620GQV-P  [MPM3620GQV-P]  60.75,20 90 bottom
U8  VND5E006ASPTR-E  [POWERSO-16]  66.5,34 180 top
U9  TLV70450  [SOT-23-5]  38.25,46 135 bottom
U10  TLV70450  [SOT-23-5]  98.25,49 0 bottom
U11  MCP1824T-1202E/OT  [SOT-23-5]  72,30.5 0 bottom
U12  MCP1824T-2502E/OT  [SOT-23-5]  68.25,30.5 0 bottom
U13  TLV70233DBVR  [SOT-23-5]  64.5,30.5 0 bottom
U$1  [ERR-DRIB]  11.75,93 270 top
U$2  [ROBOJACKETS]  66.75,80.46 0 top
U$3  [MOTOR-1]  8,58.81 270 top
U$4  [DRIBBLER]  9,88.5 270 top
U$5  [MOTOR-2]  22.5,25.31 315 top
U$6  [MOTOR-3]  96.5,10.56 45 top
U$7  [MOTOR-4]  125.5,49.56 90 top
U$8  [ERR-M1]  15.25,31 270 top
U$9  [KICKER]  133,82.06 90 top
U$10  [ERR-IMU]  48.75,83.06 0 top
U$11  [ROBOBUZZ_1.0X2]  68.25,88 0 top
U$12  [ERR-M2]  44.75,13.5 0 top
U$13  [ERR-M3]  115.75,35 45 top
U$14  [ERR-M4]  120.75,39 90 top
U$15  [ERR-KICK]  122.75,87.5 90 top
X1  ASV-18.432MHZ-EJ-T  [ASV]  69,78.25 180 bottom
XF1  30A  [3557-2]  90.25,11 270 top

## Tracks (layer width: path | path; a pad name or v marks a point on that pad's centre or on a via)
3.3V-EN
  Bottom 0.3: U13.3 63.34,29.4 R24.1
3V3-LED  (via drill 0.35)
  Top 0.3: D7.A v61.5,8
  Bottom 0.3: v61.5,8 D7.A R25.1
5V-LED  (via drill 0.35)
  Top 0.3: D5.A v61.5,5.75
  Bottom 0.3: v61.5,5.75 61.5,4.85 R23.2
18.5V-LED  (via drill 0.35)
  Top 0.3: D4.A v61.5,3.5
  Bottom 0.3: v61.5,3.5 61.5,2.6 R22.1
!CS!-ADC1  (via drill 0.35)
  Top 0.3: U1.67 60.45,73.15 60.45,74.16 59.36,75.25 v56.25,75.25 | v37.75,68 37.25,68.5 14.25,68.5 9.3,63.55 3.94,63.55 2.75,62.36 2.75,41.5 3.3,40.95 12.44,40.95 13.7,39.69 13.7,38.5 16.7,35.5 v20.75,35.5
  Bottom 0.3: v56.25,75.25 53,72 41.25,72 39.25,70 39.25,69 38.25,68 v37.75,68 | v20.75,35.5 21.73,34.52 U2.11
!CS!-ADC2  (via drill 0.35)
  Top 0.3: U1.39 74.5,74.25 80.25,80 99.25,80 101.75,82.5 116.75,82.5 119.25,80 119.25,69.5 120.25,68.5 129.75,68.5 130.75,67.5 130.75,45.5 130.25,45 126.25,45 v125.75,44.5
  Bottom 0.3: v125.75,44.5 125.25,44 U3.11
!CS!-FPGA  (via drill 0.35)
  Top 0.3: U1.69 59.5,72.1 60.1,71.5 v60.5,71.5
  Bottom 0.3: v60.5,71.5 60.5,75.61 61.39,76.5 63.25,76.5 64.25,77.5 64.25,81 67.25,84 88.95,84 KIT1.P$31
!CS!-KICK
  Top 0.3: KIT1.P$8 95.6,105.3 SB5.1
  Bottom 0.3: U4.6 97.42,98.33 96.75,99 96.75,107.28 KIT1.P$8
!CS!-RAD0
  Top 0.3: J1.10 60.48,96.17 KIT1.P$17
!CS!-RAD1
  Top 0.3: KIT1.P$3 106.23,110.5 59.49,110.5 J1.4
!RST!-KICK
  Top 0.3: KIT1.P$7 98.14,105.56 SB2.1
  Bottom 0.3: U4.7 97.78,98.97 97.25,99.5 97.25,107.54 KIT1.P$7
!RST!-RADIO
  Bottom 0.3: J1.5 47.45,101 60.23,101 KIT1.P$19
!SCS!-KICK  (via drill 0.35)
  Top 0.3: SB5.2 104.1,98.5 109.75,98.5 112.25,96 v112.25,92.5
  Bottom 0.3: U4.15 104.68,98.33 104.55,98.19 104.53,98.19 104.25,97.91 104.25,94.14 105.89,92.5 v112.25,92.5 117.25,87.5 J3.4
!SRST!-KICK  (via drill 0.35)
  Top 0.3: SB2.2 106.95,102.3 113.25,96 v113.25,90.5
  Bottom 0.3: U4.14 104.22,98.97 103.75,98.5 103.75,94 105.75,92 111.75,92 v113.25,90.5 117.25,86.5 J3.5
+1.2V  (via drill 0.35, 0.75)
  Top 0.3: U1.80 57.02,67.75 57.52,67.25 v59.25,67.25 | U1.45 71.5,72.23 71.75,71.98 v71.75,71.5 | v62.25,53.5 61.25,53.5 61,53.25 U1.115 | v75.75,58 76,57.75 U1.9
  Power 0.3: v62.75,59.5 62.75,54 v62.25,53.5 62.25,52 63.75,50.5 73.25,50.5 75.75,48 75.75,45.5 v77.75,43.5 | v74.25,27.5 74.25,28.14 71.84,30.55 50.53,30.55 48.25,28.27 48.25,19 48.3,18.95 48.3,16.31 51.06,13.55 51.2,13.55 55.25,9.5 56.25,9.5 v57.75,11
  Bottom 0.3: v71.75,71.5 71.75,71.1 C19.1 69.75,69.1 69.75,66 69.25,65.5 62.75,65.5 | C6.1 62.5,53.75 v62.25,53.5 | 62.75,65.5 v62.75,59.5 73.1,59.5 C10.1 75.5,58.25 v75.75,58 | v59.25,67.25 59.9,67.25 C14.1 61.65,65.5 62.75,65.5 | v74.25,27.5 74.35,27.6 74.35,32.25 SB7.2 77.75,38.65 v77.75,43.5
+1.2V-PRE
  Bottom 0.3: C47.1 71.15,34.55 SB7.1 72.95,31.95 U11.5
+2.5V  (via drill 0.35, 0.75)
  Top 0.3: U1.30 76.48,68.25 76.23,68.5 v75.75,68.5 | U1.65 61.5,71.75 v61.25,71.5 | U1.102 57.02,56.75 57.27,56.5 v59.25,56.5 | U1.137 72,52.9 71.4,53.5 v71.25,53.5
  Power 0.3: v61.25,71.5 61.25,70.5 60.25,69.5 | 60.25,55.5 60.25,53 63.25,50 72.25,50 74.75,47.5 v74.75,45 | 60.25,55.5 60.25,61.5 | 60.25,61.5 60.25,69.5 | 60.25,55.5 v59.25,56.5 | 60.25,69.5 v59.25,69.5 | 60.25,61.5 70.25,61.5 | 70.25,61.5 73.75,61.5 | 73.75,61.5 76.75,61.5 79.75,58.5 v79.75,56.5 | 70.25,61.5 70.25,54.5 v71.25,53.5 | 73.75,61.5 73.75,66.5 v75.75,68.5 | v55.25,11 52.25,14 51.25,14 48.75,16.5 48.75,28.14 50.71,30.1 71.65,30.1 73.25,28.5 73.25,26.5 74.25,25.5 v74.5,25.5
  Bottom 0.3: R11.2 57.65,69.5 v59.25,69.5 | C15.1 75.35,68.5 v75.75,68.5 | C20.1 61.35,71.5 v61.25,71.5 | C9.1 60.1,56.5 v59.25,56.5 | C4.1 71.25,54.15 v71.25,53.5 | v79.75,56.5 77.5,56.5 R10.2 | SB8.2 66.25,34.9 66.25,37.75 73.5,45 v74.75,45 78.25,45 79.25,44 79.25,30.5 74.5,25.75 v74.5,25.5
+2.5V-PRE
  Bottom 0.3: C48.1 SB8.1 69.1,31.91 U12.5
+3.3V  (via drill 0.35, 0.75)
  Top 0.25: C33.1 C31.1 | C31.1 56.05,81.95 U5.13 | C31.1 56.6,82.5 v57.75,82.5 | v52.25,83.75 51.75,83.25 D2.A | U5.8 57.66,77.74 C37.1 60.25,76.4 | 60.25,76.4 C36.1 | 60.25,76.4 60.25,75.5 60.75,75 v61.25,75
  Top 0.3: U1.100 58,57.75 v58.25,57.5 | D9.A 13,30.25 v13,29.5 | v124.75,38.5 124.25,38.5 D11.A | v45.25,13 44.75,12.5 D8.A | v58.25,9 61.5,12.25 D6.A 62.5,14 v62.75,14 | U1.79 58,68.25 v58.25,68.5 | KIT1.VDD 114.31,86.5 D3.A | v75.65,67.25 U1.28 | v69.25,71.5 69.5,71.75 U1.49 | U1.42 73,71.75 v72.75,71.5 | 63.75,71.5 65.25,71.5 65.5,71.75 U1.57 | 63.75,71.5 v62.25,71.5 | U1.64 62,71.75 v62.25,71.5 | U1.62 63,71.73 62.77,71.5 v62.25,71.5 | v64.75,53.5 64.25,53.5 64,53.25 U1.121 | U1.138 72.5,52.9 72.75,53.15 v72.75,53.5 | U1.143 75,52.77 74.75,53.02 v74.75,53.5 | R7.2 75.25,90.85 | 75.25,90.85 R6.2 | v120.25,35 120.04,34.79 D12.A | U1.13 76,59.75 v75.75,60 | 75.25,90.85 75.25,91.25 v75.5,91.5 | U6.7 U6.8 89.01,100.76 v89.25,101 89.75,101.5 C40.1 | D10.A 11.25,92.5 11.75,92.5 14.15,94.9 14.15,97.9 v14.25,98 | 63.75,71.5 64,71.75 U1.60
  Bottom 0.3: v106.75,94 U4.20 | v106.75,94 | v97.75,94 U4.1 | v97.75,94 | R5.1 v58.25,9 | C16.1 60.25,68.5 v58.25,68.5 | v75.65,67.25 75.57,67.25 74.75,66.43 74.75,65.65 C13.1 74.75,65.35 v74.75,64 74.75,62 74.35,61.6 C12.1 75.25,60.5 v75.75,60 | C17.1 68.75,71 v69.25,71.5 | C21.1 72.75,70.15 v72.75,71.5 72.75,73.1 R12.1 | v62.25,71.5 63.25,71.5 64.4,70.35 C18.1 | C11.1 59.15,57.5 v58.25,57.5 | C7.1 v64.75,53.5 | C5.1 72.75,54.4 v72.75,53.5 | C8.1 75.25,54 v74.75,53.5 | X1.4 66.73,76.52 | 66.73,76.52 69.65,79.44 C22.1 | v66.25,82 66.46,81.79 X1.1 66.46,76.79 66.73,76.52 | IC1.15 27.77,92.53 28.25,93 28.25,94 27.77,94.47 | 27.77,94.47 IC1.18 25.89,94.47 25.51,94.85 C23.1 | 27.77,94.47 27.8,94.5 29.25,94.5 v30.25,95.5 30.52,95.78 IC1.9 | U11.1 72.95,29.8 72.25,30.5 71.86,30.5 71.05,29.69 U11.3 70.36,28.5 69.89,28.5 U12.1 69.2,30.07 69.02,30.25 67.5,30.25 67.3,30.05 U12.3 66.75,28.64 v66.75,26.25 | C30.1 107.1,93.65 v106.75,94 | C32.1 97.4,93.65 v97.75,94
  pour Power (isolate 0.4, rank 2, no thermals): 0.25,92.5 0.25,36.5 36.5,0.25 97,0.25 133.25,36.5 133.25,92.5 111,114.75 105.75,114.75 22.5,114.75
+3V3  (via drill 0.35, 0.75)
  Top 0.3: M1:U1.19 M1:U1.20 45.75,63 46.25,63.5 v46.25,63.75 | M1:U1.45 36.15,55 35.15,54 v35.15,53.25 M1:C10.1 | DD:R1.1 43.75,81.9 v43.75,81.5 | DD:U1.45 30.15,78.5 29.75,78.1 29.75,75.35 DD:C1.1 30.65,74.25 33.5,74.25 v34.75,75.5 | M2:U1.20 M2:U1.19 | v47.25,38.5 47.25,37.74 M2:U1.45 46,36.49 46,35.8 M2:C1.1 | v97.75,70.5 M4:U1.45 99.85,70.5 100.25,70.9 100.25,72.1 98.1,74.25 M4:C1.1 | M4:U1.19 M4:U1.20 90.65,62.5 89.75,61.6 v89.75,59.5 89.75,58.9 M4:C10.1 | v94.75,43 95.01,43 M3:U1.45 96.51,41.5 96.83,41.5 98.6,43.28 M3:C10.1 | M3:U1.19 M3:U1.20 84.2,42.5 v83.25,42.5 82.75,42.5 81.25,41 81.25,40 M3:C1.1 | DD:C10.1 40.25,86.75 v40,86.5 39.85,86.5 39.35,86 DD:U1.19 | M2:U1.20 | M2:U1.20 47.2,49 v47.25,49
  Power 0.7: v76.75,46 80.25,42.5 v83.25,42.5 86.25,39.5 91.25,39.5 v94.75,43 94.75,46.5 89.75,51.5 v89.75,59.5 93.25,63 95.75,63 97.75,65 v97.75,70.5 | v55.25,38.5 v47.25,38.5 43.75,42 43.75,45.5 | 43.75,45.5 v47.25,49 | 43.75,45.5 38.5,50.75 | 38.5,50.75 38.25,51 36.75,51 35.15,52.6 v35.15,53.25 | 38.5,50.75 40.75,53 43.25,53 44.75,54.5 44.75,62.25 45.62,63.12 | 45.62,63.12 v46.25,63.75 46.25,65.5 43.75,68 43.75,74.5 39.75,78.5 | 39.75,78.5 42.75,81.5 | 42.75,81.5 v43.75,81.5 | v40,86.5 42.75,83.75 42.75,81.5 | 39.75,78.5 36.75,75.5 v34.75,75.5 | 45.62,63.12 47.75,61 v47.75,60
  Bottom 0.3: M1:R1.1 49.85,58.55 48.4,60 v47.75,60 | v46.25,63.75 46.25,65.15 M1:C1.1 | v47.25,49 44.6,46.35 M2:C10.1 | M2:R1.1 46.75,39.75 46.75,39 v47.25,38.5 | M4:R1.1 97.35,70.5 v97.75,70.5 | R25.2 59.8,7 v58.25,7 56.75,8.5 56.75,28.5 55.75,29.5 54.25,29.5 53.25,30.5 53.25,36.5 v55.25,38.5 | SB9.2 62.75,34.65 62.75,37.5 v62,38.5 | M3:R1.1 94,43 v94.75,43
  Bottom 0.7: v55.25,38.5 v62,38.5 63,39.5 66.75,39.5 70.75,43.5 70.75,45 71.75,46 v76.75,46
+3V3-PRE
  Bottom 0.3: C49.1 SB9.1 65.35,31.91 U13.5
+5V  (via drill 0.35, 0.75)
  Top 0.3: LED2.1 25.55,103.3 v25.25,103 | LED1.1 27.75,108.55 v27.75,108 | v88.75,89.5 88,90.25 R3.1 | U6.1 85.34,100.76 C38.1 84.75,101.65 v84.75,103 | C39.1 86.75,102.7 v86.75,104.5
  Top 0.7: v55.1,34.5 51.25,30.65 51.25,27 47.75,23.5 v47.75,8.5
  Power 0.3: 110.84,89.5 v88.75,89.5
  Power 0.7: 46.25,8.5 37.25,8.5 24.75,21 | 46.25,8.5 44.45,6.7 M2:J2.4 | 6.75,50 6.75,41.5 10.75,37.5 10.75,35 12.25,33.5 | 6.75,50 6.75,53 | 6.75,53 6.75,62.5 3.25,66 3.25,82 | 21.75,92.5 25.25,96 v25.25,103 27.75,105.5 v27.75,108 | 24.75,21 20.25,25.5 | 20.25,25.5 12.25,33.5 | 21.75,92.5 12.75,92.5 12.25,92 4.75,92 3.25,90.5 3.25,82 | 6.75,53 4.5,53 M1:J1.4 | 24.75,21 24.28,21 M2:J1.4 | 46.25,8.5 v47.75,8.5 51.75,8.5 55.25,5 v58.25,5 58.75,4.5 63.25,4.5 66.25,1.5 95.25,1.5 107.75,14 | M3:J2.4 123.49,30 123.75,30 | KIT1.VIN 110.84,102.5 | 107.75,14 117.5,23.75 | 117.5,23.75 123.75,30 | M3:J1.4 107.48,14 107.75,14 | 123.75,30 124.75,30 131.25,36.5 131.25,40.5 | 131.25,54.5 131.25,67 | 131.25,67 131.25,76 118.25,89 111.34,89 110.84,89.5 110.84,102.5 | 131.25,54.5 131,54.25 M4:J1.4 | v17.25,60.75 17.75,60.25 v17.75,55.5 17.75,51 v16.75,50 6.75,50 | 20.25,25.5 26.25,31.5 v27.25,31.5 27.75,31.5 v32.25,27 36.75,22.5 v36.75,22 | 117.5,23.75 110.75,30.5 108.75,30.5 v107.25,29 107.25,28 v103.25,24 99.75,20.5 v96.75,20.5 | 131.25,67 119.75,67 118.25,65.5 v118.25,63.5 v118.25,57.5 v118.25,51 | M1:J2.4 9.6,30.85 12.25,33.5 | 131.25,54.5 131.25,40.5 | M4:J2.4 131.15,40.6 131.25,40.5 | 87.75,102.5 86.75,103.5 v86.75,104.5 | 110.84,102.5 87.75,102.5 | 87.75,102.5 85.25,102.5 v84.75,103 | 3.25,82 DD:J1.5 | 21.75,92.5 30.75,92.5 33.25,95 43.94,95 45.17,96.23 J1.6
  Bottom 0.3: M3:U4.5 96.75,20.67 v96.75,20.5 | M3:U3.5 101.66,25.59 | 101.66,25.59 | 101.66,25.59 v103.25,24 102.85,23.6 M3:C4.1 | M4:U4.5 117.8,51.45 v118.25,51 | M4:U3.5 117.8,57.95 v118.25,57.5 | M4:U2.5 117.8,63.95 v118.25,63.5 | M2:U3.5 32.42,27 v32.25,27 | M2:U2.5 37.42,22 v36.75,22 | M2:U4.5 27.92,31.5 | 27.92,31.5 v27.25,31.5 27.15,31.6 M2:C4.1 | M1:U2.5 16.75,47.02 v16.75,50 | M1:U3.5 17.75,53.52 v17.75,55.5 | M1:U4.5 17.25,59.02 v17.25,60.75 17,61 M1:C4.1 | M1:U3.7 17.77,51.67 18.25,52.16 18.25,55 v17.75,55.5 | M1:U2.7 17.27,45.67 17.75,46.16 17.75,47.5 16.75,48.5 v16.75,50 | M2:U4.7 29.97,30.26 29.97,30.87 29.34,31.5 27.92,31.5 | M2:U3.7 34.47,25.76 34.47,26.37 33.34,27.5 32.75,27.5 v32.25,27 | M2:U2.7 39.47,20.76 39.47,21.37 38.34,22.5 37.25,22.5 v36.75,22 | M3:U4.7 98.22,22.32 97.82,22.72 96.97,22.72 96.25,22 96.25,21 v96.75,20.5 | M3:U3.7 102.71,28 102.25,28 101.25,27 101.25,26 101.66,25.59 | M4:U4.7 117.08,53.33 116.75,53 116.75,51.5 117.25,51 v118.25,51 | M4:U3.7 117.08,59.83 116.75,59.5 116.75,58 117.25,57.5 v118.25,57.5 | M4:U2.7 117.08,65.83 116.75,65.5 116.75,64 117.25,63.5 v118.25,63.5 | v16.75,50 16.1,50 M1:C11.1 | v17.75,55.5 17.25,55 M1:C5.1 | M2:C5.1 31.35,26.1 v32.25,27 | M2:C11.1 36.35,21.6 v36.75,22 | M4:C11.1 119.25,62.5 v118.25,63.5 | M4:C4.1 119.25,56.5 v118.25,57.5 | M3:C5.1 96.75,18.7 v96.75,20.5 | M3:C11.1 106.5,28.25 v107.25,29 | 101.66,25.59 | v107.25,29 105.75,30.5 105.75,31.5 106.75,32.5 107.21,32.5 M3:U2.7 | M1:U4.7 18.08,57.67 18.25,57.5 18.25,56 v17.75,55.5 | M4:C5.1 118.9,51 v118.25,51 | M3:U2.5 107.25,30.62 v107.25,29 | v58.25,5 59.65,5 R23.1
  Bottom 0.5: U13.1 65.45,30.3 65.25,30.5 62.55,30.5 61.85,31.2
  Bottom 0.7: v55.1,34.5 56.85,36.25 60.41,36.25 61.85,34.81 SB6.2 61.85,31.2 R24.2
+5V-FUSE
  pour Bottom (no thermals): 58.25,22.5 58.25,20.25 60.5,20.25 60.5,22.5 60.25,23 60.25,27.5 58.75,27.5 58.75,23
  pour Bottom (no thermals): 60.25,27.5 60.25,25.5 58.25,25.5 58.25,30 60.25,30
+5V-PRE2
  Bottom 0.3: F1.2 59.25,32.85 SB6.1
+18.5V  (via drill 0.35, 0.75)
  Top 0.3: DD:U1.25 29.25,88.5 26.59,91.16 v22.25,91.16 | M2:U1.25 38.75,43.38 v38.75,43 | M4:U1.25 101.25,58.25 101.25,56 v104.25,53 | M1:U1.25 28.25,65 M2:C12.1 | v89.75,28.5 88.25,30 88.25,34.45 M3:U1.25 | R8.1 72.65,40.5 73.25,40.5 86.25,27.5 v86.75,27.5 | R1.1 97,87.75 v96.75,87.5
  Power 0.3: v96.75,87.5 96.75,83.5 98.25,82 106.25,82 108.75,79.5 v108.75,79
  Bottom 0.25: 49.25,20 49.75,20.5
  Bottom 0.3: v38.75,43 37.75,43 33.75,39 33.75,37.62 M2:Q5.5678 | R22.2 v58.25,2.5 56.25,2.5 49.25,9.5 49.25,20 | 49.75,20.5 50.75,21.5 M3:C12.1
  Bottom 0.6: 33.75,39 33.75,41.3 C42.1 37.74,45.29 37.74,46.51 U9.2 | U10.2 98.25,48.5 98.75,49 100.9,49 C43.1 100.25,51.35 M4:C12.1
  other vias: 51.25,25.5 52.25,25.5 53.25,25.5 54.25,25.5 54.25,24.5 54.25,23.5 53.25,23.5 53.25,24.5 52.25,24.5 52.25,23.5 51.25,23.5 51.25,24.5
  pour Bottom (no thermals): 22.75,73.5 18.25,73.5 17.75,73.5 17.75,94.5 17.25,95 17.25,98 19.25,98 19.25,95.5 19.75,95 22.75,92 22.75,90.5
  pour Bottom (no thermals): 17.75,77.5 17.75,64.25 22.22,64.25 25.25,61 25.25,56.5 30,56.5 30,61 27.25,64 27.25,69 22.75,73.5 22.75,77.5
  pour Bottom (no thermals): 25.25,59.5 25.25,43.5 30,43.5 30,59.5
  pour Bottom (no thermals): 25.25,46.5 25.25,42.5 31.25,36.5 33.75,34 37.25,37.5 34.25,40.5 33.25,40.5 30,43.5 30,46.5
  pour Bottom (no thermals): 31.75,36 43.25,24.5 46.75,28 34.75,40 31.25,36.5
  pour Bottom (no thermals): 40.25,27.5 48.25,19.5 53.25,19.5 55.75,22 55.75,28 46.75,28 43.75,31
  pour Bottom (no thermals): 106,67 106,74.75 103.75,77 103.75,79.5 112.75,79.5 112.75,76.5 110.75,74.5 110.5,74 110.5,71 110.25,67
  pour Bottom (no thermals): 106,71.5 106,54 110.25,54 110.5,54 110.5,71.5
  pour Bottom (no thermals): 106,58.5 106,45 99.25,38.5 102.75,35 105.75,38 105.75,38.5 110.75,43.5 110.75,58.5
  pour Bottom (no thermals): 99.25,53.5 99.25,51.5 110.25,51.5 110.25,53.5
  pour Bottom (no thermals): 102.5,41.75 90.25,29.5 93.75,26 105.75,38 105.75,38.5
  pour Bottom (no thermals): 85,26.25 86.75,28 88.75,28 93.25,32.5 96.75,29 92.25,24.5 90.75,24.5 88.75,22.5
  pour Bottom (no thermals): 66.25,19.5 66.25,22 67.75,22 68.75,21 69.75,21 69.75,17.5 70.75,16.5 86.25,16.5 86.25,15 70.25,15 68.75,16.5 68.75,19 68.25,19.5
  pour Bottom (no thermals): 62.5,19.9 66.25,19.9 66.25,20.5 67.75,20.5 67.75,19.6 62.5,19.6
  pour Power (no thermals): 93.75,3 87.75,3 84.75,6 84.25,6 79.75,6 78.25,6 76.25,6 75.25,6 66.25,15 62.25,15 58.75,18.5 58.25,19 51.25,19 50.75,19.5 50.75,26 50.75,27 51.75,28 55.75,28 57.25,28 57.75,27.5 59.25,26 60.25,25 60.25,23 61.75,21.5 62.75,21.5 66.75,21.5 71.75,16.5 73.75,16.5 80.25,10 85.25,10 86.75,10 87.75,10 88.25,10 93.75,4.5
  pour Bottom (no thermals): 93.75,5.5 93.75,2.5 87.25,2.5 81.75,8 81.75,20 81.75,23 86.75,28 87.25,28 90.75,24.5 86.75,20.5 86.75,15.5 86.75,12.5
AAM
  Bottom 0.2: U7.18 63.75,18.2 63.75,17.4 R15.2
ADC1-5V  (via drill 0.35)
  Power 0.6: v33.75,46.5 33.75,43 30.25,39.5 v26.75,39.5
  Bottom 0.3: U2.10 20.75,34.5 20.25,35 19.75,35 | 19.75,35 19.25,34.5 U2.7 | 19.75,35 19.75,35.5 20.75,36.5 23.75,36.5 C25.1 | U2.17 U2.16 22.27,30.02 26.25,34 26.25,36 24.75,37.5
  Bottom 0.6: v26.75,39.5 26,38.75 | C29.1 26,38.75 | 26,38.75 C27.1 | 26,38.75 | 26,38.75 24.75,37.5 C25.1 | v33.75,46.5 33.75,48 C45.1 35.04,48.51 37.08,48.51 U9.3
ADC2-5V  (via drill 0.35)
  Power 0.6: v104.75,47.5 104.75,46.5 105.25,46 113.25,46 v115.75,48.5 120.25,44 120.25,41 121.75,39.5 v124.75,39.5
  Bottom 0.3: U3.10 124.25,44.98 125.75,46.48 125.75,47.5 124.55,48.7 C28.1 | v124.75,39.5 124.25,39.5 123.75,40 U3.16 U3.17 | U3.7 122.25,48.2 | 122.25,48.2
  Bottom 0.6: v115.75,48.5 117.1,49.85 C24.1 119.4,48.2 C26.1 122.25,48.2 123,48.2 C28.1 | U10.3 97.3,46.45 97.75,46 99.25,46 100.1,45.15 C46.1 101.75,45 104.25,47.5 v104.75,47.5
BATT-FPGA
  Top 0.3: U1.136 71.5,49.75 75.5,45.75 75.5,44.6 C3.1 | C3.1 R9.1 | C3.1 R8.2
BOLT1  (via drill 3.8 pad 7.2)
  other vias: 9.75,96.44
BOLT2  (via drill 3.8 pad 7.2)
  other vias: 123.75,96.44
BOLT3  (via drill 3.8 pad 7.2)
  other vias: 115.25,40.44
BOLT4  (via drill 3.8 pad 7.2)
  other vias: 18.25,40.44
BOLT5  (via drill 3.8 pad 7.2)
  other vias: 82.75,75.5
CPOUT
  Top 0.25: C34.1 51.63,79.28 U5.20
CS1
  Top 0.3: U8.10 64.5,26.75 63.75,26 R18.2
CS2
  Top 0.3: R19.2 71.35,25.5 69.75,25.5 68.5,26.75 U8.15
CS-DIS
  Top 0.3: R17.2 66.1,25.5 U8.12
DD-!CS
  Top 0.3: DD:U1.4 39.35,78.5 39.58,78.27 39.58,75.67 48.25,67 50.4,67 RN6.11
DD-A-H  (via drill 0.35)
  Top 0.3: RN6.9 42.75,76.25 v42.75,77.5 | DD:U1.13 37.65,83 37.25,82.6 v37.25,82.5
  Bottom 0.3: v42.75,77.5 37.75,82.5 v37.25,82.5
DD-A-L  (via drill 0.35)
  Top 0.3: RN8.16 50.13,69.95 43.75,76.33 v43.75,77.5 | DD:U1.14 37.5,83.5 v37.25,83.75
  Bottom 0.3: v37.25,83.75 37.5,83.75 v43.75,77.5
DD-B-H  (via drill 0.35)
  Top 0.3: DD:U1.15 40.15,84 v40.25,83.9 | v44.75,78.5 44.75,76.13 50.13,70.75 RN8.15
  Bottom 0.3: v44.75,78.5 42.75,80.5 42.75,82 40.85,83.9 v40.25,83.9
DD-B-L
  Top 0.3: RN8.14 50.13,71.55 45.75,75.93 45.75,83.5 44.75,84.5 DD:U1.16
DD-C-H
  Top 0.3: RN8.13 50.13,72.35 46.25,76.23 46.25,84 45.25,85 DD:U1.17
DD-C-L
  Top 0.3: DD:U1.18 45.75,85.5 46.75,84.5 46.75,76.53 50.13,73.15 RN8.12
DD-H1
  Top 0.3: RN8.11 50.13,73.95 47.25,76.83 47.25,86.5 43.25,90.5 37.25,90.5 36.75,90 28.75,90 26.75,92 15.1,92 9.1,86 DD:J1.3
DD-H2
  Top 0.3: RN8.10 50.13,74.75 47.75,77.13 47.75,87 43.75,91 36.75,91 36.23,90.48 29.08,90.48 27.06,92.5 22.4,92.5 22.39,92.5 14.76,92.5 10.25,88 DD:J1.2
DD-H3
  Top 0.3: RN8.9 48.25,77.75 48.25,87.5 44.25,91.5 36.3,91.5 35.73,90.93 29.27,90.93 27.2,93 14.61,93 11.61,90 DD:J1.1
DD:AVDD
  Top 0.3: DD:U1.23 40.15,88 DD:C2.1
DD:BST-A
  Top 0.3: DD:U1.44 29.75,79 28.75,78 27.25,78 25.75,76.5 25.75,73 25,72.25 DD:C6.1
DD:BST-B
  Top 0.3: DD:U1.39 30.15,81.5 29.65,81 26.75,81 24.5,78.75 DD:C7.1
DD:BST-C
  Top 0.3: DD:C8.1 27,85.25 28.75,83.5 29.65,83.5 30.15,84 DD:U1.34
DD:CP1
  Top 0.3: DD:C3.1 40.15,81.5 DD:U1.10
DD:CP2
  Top 0.3: DD:U1.11 39.75,82 40.65,82 DD:C3.2
DD:EN-GATE
  Top 0.3: DD:R1.2 42.07,82.75 41.62,83.2 40.38,83.2 39.7,82.52 39.7,82.5 DD:U1.12
DD:GH-A  (via drill 0.35)
  Top 0.3: DD:U1.43 29,79.5 28,78.5 v26.25,78.5
  Power 0.3: v26.25,78.5 25.75,78 15.75,78 v15.25,78.5
  Bottom 0.3: v15.25,78.5 15.98,77.77 DD:Q1.4
DD:GH-B  (via drill 0.35)
  Top 0.3: DD:U1.38 28.25,82 v27.75,81.6
  Power 0.3: v27.75,81.6 27.75,83.5 26.25,85 v15.25,85
  Bottom 0.3: v15.25,85 15.25,84.63 DD:Q3.4
DD:GH-C  (via drill 0.35)
  Top 0.3: DD:U1.33 28.85,84.5 v27.25,86.1
  Power 0.3: v27.25,86.1 27.25,88 25.25,90 17.41,90 v16.25,91.16
  Bottom 0.3: v16.25,91.16 15.98,90.88 DD:Q5.4
DD:GL-A
  Top 0.3: DD:U1.41 27.25,80.5 24.16,77.41 DD:Q2.4
DD:GL-B
  Top 0.3: DD:U1.36 28.25,83 27.34,83.91 DD:Q4.4
DD:GL-C
  Top 0.3: DD:U1.31 29.75,85.5 27.75,87.5 27.75,88.5 25.84,90.41 DD:Q6.4
DD:GVDD
  Top 0.3: DD:C9.1 42.2,79.8 40.38,79.8 39.7,80.48 39.7,80.65 39.35,81 DD:U1.9
DD:PHASE-A  (via drill 0.35)
  Top 0.3: DD:U1.42 28.25,80 v27.75,79.5 | v16.75,72.5 16.75,74.5 17.5,75.25 | DD:Q2.5678 17.68,75.43 17.5,75.25 | DD:C6.2 18.5,72.25 17.5,73.25 17.5,75.25
  Power 0.3: v27.75,79.5 27.75,79 26.25,77.5 18.75,77.5 16.75,75.5 v16.75,72.5
  other vias: 14.75,76 14.75,75 14.75,74 13.75,74.5 13.75,75.5
  pour Bottom (no thermals): 16.75,76.5 13.25,76.5 13.25,73.5 16.75,73.5
  pour Top (no thermals): 16.75,76.5 16.75,73.5 13.25,73.5 11.25,75.5 6.25,75.5 6.25,76.5
DD:PHASE-B  (via drill 0.35)
  Top 0.3: DD:U1.37 27.25,82.5 v26.75,82 | v17.25,79 17.25,81.57 DD:Q4.5678 17.68,80.07 19,78.75 DD:C7.2
  Power 0.3: v26.75,82 26.75,81.5 24.25,79 v17.25,79
  other vias: 14.75,82.5 14.75,81.5 14.75,80.5 13.75,81 13.75,82
  pour Bottom (no thermals): 16.75,83 13.25,83 13.25,80 16.75,80
  pour Top (no thermals): 16.75,83 16.75,80 13.75,80 11.25,77.5 6.25,77.5 6.25,78.5 9.75,78.5 12.25,81 12.25,83
DD:PHASE-C  (via drill 0.35)
  Top 0.3: v16.75,85.65 16.75,87.57 DD:Q6.5678 17.68,86.07 18.5,85.25 DD:C8.2 | DD:U1.32 29.61,85 27.61,87 26.25,87 v25.75,86.5
  Power 0.3: v25.75,86.5 24.9,85.65 v16.75,85.65
  other vias: 14.75,89 14.75,88 14.75,87 13.75,87.5 13.75,88.5
  pour Bottom (no thermals): 16.75,89.5 13.25,89.5 13.25,86.5 16.75,86.5
  pour Top (no thermals): 16.75,89.5 16.75,86.5 13.25,86.5 10.75,84 10.75,82 8.25,79.5 6.25,79.5 6.25,80.5 7.25,80.5 8.75,82 8.75,84.5 13.75,89.5
DIP-1  (via drill 0.35)
  Top 0.3: v34.75,103 35.04,102.71 S2.1
  Bottom 0.3: IC1.22 30.33,97.08 31.75,98.5 31.75,101.5 33.25,103 v34.75,103
DIP-2  (via drill 0.35)
  Top 0.3: S2.2 31,99.55 v31,99.5
  Bottom 0.3: IC1.23 29.48,97.72 v31,99.5
DIP-3  (via drill 0.35)
  Top 0.3: S2.3 29.96,100.21 v29.25,99.5
  Bottom 0.3: IC1.24 28.12,98.38 v29.25,99.5
DOT-CLK  (via drill 0.35)
  Top 0.3: LED1.5 23.75,111 24.75,112 24.75,112.5 25.8,113.55 30.7,113.55 v31.2,113.05
  Bottom 0.3: KIT1.P$6 100.68,110.93 98.61,113 31.25,113 v31.2,113.05
DOT-CLK-INTER
  Top 0.3: LED1.2 26.25,111 25.25,110 25.25,106.5 23.75,105 LED2.5
DOT-DATA  (via drill 0.35)
  Top 0.3: LED1.4 v24.3,114
  Bottom 0.3: KIT1.P$4 100.54,113.65 24.65,113.65 v24.3,114
DOT-DATA-INTER
  Top 0.3: LED1.3 26.5,112.7 26.3,112.5 26.25,112.5 24.75,111 24.75,108 23.45,106.7 LED2.4
EN
  Bottom 0.2: U7.17 63.53,19.25 64.53,18.25 R16.2
EN-PWR  (via drill 0.35)
  Top 0.3: S3.2 126.25,79 130.75,79 131.75,78 131.75,37.5 95.75,1.5 81.39,1.5 69.82,13.07 69.82,21.07 70.75,22 72.75,22 75.25,24.5 75.25,26 74.75,26.5 70.25,26.5 69.3,27.45 U8.16 69.25,28.05 69.25,29 68.75,29.5 64.33,29.5 63.7,28.87 U8.9 63.7,27.95 60.75,25 60.75,22.5 65.75,17.5 v65.75,13.5
  Bottom 0.3: R16.1 67.85,17.25 67.85,14.6 66.75,13.5 v65.75,13.5
EN-PWR-PRE  (via drill 0.35)
  Top 0.3: S3.1 123.06,79.5 130.75,79.5 130.8,79.45 130.94,79.45 132.25,78.14 132.25,37.07 96.18,1 81.25,1 69.25,13 69.25,21.5 70.25,22.5 72.25,22.5 73.25,23.5 v73.25,24.5
  Bottom 0.3: R14.2 72,25.65 72,25 | 72,25 R13.1 | v73.25,24.5 72.75,25 72,25
FB
  Bottom 0.2: U7.1 62.3,17.7 R21.2
  Bottom 0.3: R21.2 60.6,15.85 59.25,14.5 58.25,14.5 57.25,15.5 57.25,23.6 R20.1
FPGA-CLK  (via drill 0.35)
  Top 0.3: v69.25,76 69,75.75 U1.50
  Bottom 0.3: X1.3 71.29,76 v69.25,76
FPGA-DONE  (via drill 0.35)
  Top 0.3: U1.72 57.9,73 v57.25,73 | v62.25,81.5 62.75,82 62.75,93.36 KIT1.P$15
  Bottom 0.3: R11.1 56.15,73 v57.25,73 57.25,74 62.25,79 v62.25,81.5
FPGA-INIT  (via drill 0.35)
  Top 0.3: U1.40 74,71.75 v74.25,71.5 | v75.75,79.5 72.75,79.5 68.75,83.5 68.75,96.82 KIT1.P$14
  Bottom 0.3: v74.25,71.5 74.6,71.85 R12.2 75.75,74.4 v75.75,79.5
FPGA-PROG  (via drill 0.35)
  Top 0.3: U1.1 77.75,53.35 v77.75,53 | v76.75,80 76.25,80.5 72.75,80.5 71.27,81.98 71.27,86.98 69.75,88.5 69.75,95.28 KIT1.P$13
  Bottom 0.3: R10.1 77.75,54.4 v77.75,53 78.25,53 80.75,55.5 80.75,57 77.75,60 77.75,79 v76.75,80
GND  (via drill 0.35, 1.02)
  Top 0.25: U5.1 53.49,75.76 53.75,75.5 v54.25,75.5 | C34.2 52.15,81.5 v52.75,81.5 | v52.75,81.5 52.75,81.33 U5.18 | v52.75,81.5 52.75,83 53.6,83.85 C33.2 C31.2 | U5.9 58.86,78.24 C37.2 60.25,78.1 | 60.25,78.1 C36.2 | 60.25,78.1 60.35,78.2 C35.2 60.35,81.4 v60.25,81.5 | U5.11 57.53,79.28 57.75,79.5 57.75,80.25 v57.5,80.5
  Top 0.3: U1.90 v58.75,62.75 | U1.99 58,58.25 v59.25,59.5 | M1:U1.24 42.75,65 41.75,64 v41.75,60 | M1:U1.3 41.75,54.5 40.75,55.5 v40.75,58 | M1:U1.30 39.75,62.5 40.75,61.5 v40.75,60 | M1:C10.2 36.75,51.6 v36.75,52.75 36.75,53.25 M1:U1.48 M1:U1.47 M1:U1.46 39.25,54.5 39.75,55 v39.75,58 | DD:C10.2 41.6,88 v41.25,88 41.85,88 DD:C2.2 | DD:C9.2 44.75,80.65 v44.75,81.5 | DD:C1.2 32.6,76.5 v34.75,76.5 31.5,76.5 DD:U1.48 DD:U1.47 DD:U1.46 33.25,78 33.75,78.5 v33.75,82 33.75,81.5 33.25,81 DD:U1.40 | M2:U1.24 44.23,48.87 44.23,46.52 v46.25,44.5 | M2:U1.30 43.33,44.42 44.83,44.42 v45.75,43.5 | M2:U1.3 50.75,40.53 48.72,40.53 v46.75,42.5 48.75,40.5 48.75,38.5 46.99,36.74 M2:U1.46 M2:U1.47 M2:U1.48 48.2,35.5 48.75,35.5 | M2:U1.8 49.85,43.17 49.85,43.16 49.5,42.81 49.25,42.57 48.18,42.57 v47.75,43 | 48.75,35.5 49.35,34.9 M2:C1.2 | 48.75,35.5 49.25,36 v49.25,36.5 | S2.6 S2.5 S2.4 29.96,93.71 v30.75,94.5 | M4:U1.35 v96.25,65.5 | M4:U1.47 M4:U1.48 98,73 v97.25,73 95.9,73 M4:C1.2 | M4:U1.47 M4:U1.46 | M4:C2.2 M4:C10.2 91.85,60.4 91.75,60.5 M4:U1.24 92.75,60.5 94.25,62 v94.25,65.5 | M3:C10.2 97.35,45.6 v96.25,44.5 96.97,43.78 M3:U1.48 M3:U1.47 M3:U1.46 94.72,44 93.75,44 v91.75,42 92.47,42 M3:U1.40 | M3:C2.2 | 84.9,38.15 85.75,39 84.87,39 M3:U1.24 | D1.C D7.C v60,5.75 D5.C v60,3.5 D4.C | U1.19 76,62.75 v75.75,63 | U1.27 76,66.75 75.75,66.5 v75.75,66 | U1.46 71,72.23 70.77,72 70.75,72 v70.25,71.5 | U1.37 v75.5,71.5 | U1.55 66.5,71.75 v66.25,71.5 | U1.61 v63.5,74.5 | U1.118 62.5,52.9 63.5,53.9 v63.5,54 | U1.127 v67,53.5 | U1.133 v70,53.5 | LED1.6 21.45,109.3 v20.75,110 | LED2.6 21.05,103.3 v20.75,103 | v67.75,26 67.75,26.28 66.9,27.13 U8.13
  Top 0.3: R19.1 70.1,23.65 v69.75,24 | R4.2 92.5,92.15 v92.5,92.25 | C1.2 93.4,91.35 v92.5,92.25 | C3.2 75.4,40 v76.75,40 76.25,40.5 R9.2 | U1.11 76,58.75 v75.75,59 | M3:C2.2 M3:C1.2 84.9,38.15 | M3:C2.2 | 84.9,38.15 | C2.2 92.5,92.6 | 92.5,92.6 v92.5,92.25 | R2.2 92.5,92.6 | M3:U1.3 92.75,45.97 92.75,45 90.75,43 v90.75,42.5 | M3:U1.35 90.44,40.5 v89.75,40.5 88.9,39.65 88.9,38.5 M3:U1.30 | M3:U1.8 90.75,44.43 90.75,44 v90.25,43.5 | M4:U1.8 93.75,68.5 94.25,68 v94.25,67.5 | M4:U1.40 96.75,68 v96.25,67.5 96.25,71 96.75,71.5 M4:U1.47 | M4:U1.30 96.25,63 95.25,64 v95.25,65.5 | M4:U1.3 94.25,71 95.25,70 v95.25,67.5 | DD:U1.8 36.25,80.5 35.75,81 v35.75,82 | DD:U1.35 33.25,83.5 v33.75,84 33.75,85.5 33.25,86 DD:U1.30 | DD:U1.20 36.25,86.5 35.75,86 v35.75,84 | DD:U1.24 36.75,88.5 34.75,86.5 v34.75,84 | DD:U1.3 35.75,78 34.75,79 v34.75,82 | M1:U1.8 42.25,57 41.75,57.5 v41.75,58 | M2:U1.35 44.75,42.31 v44.75,43 45,42.75 M2:U1.PAD v46.25,41.5 46.25,40.27 M2:U1.40 | M1:U1.PAD 39.75,58.25 v39.75,58 | M1:U1.40 39.25,57.5 v39.75,58 | M1:U1.35 v39.75,60 | C40.2 91.25,102.35 v91.25,104 | C38.2 82.9,102.65 v83.25,103 | U6.4 v85.76,98.5 v85.75,98.5 | C39.2 88.45,103.2 v89.25,104 | U1.73 57.02,71.25 57.77,70.5 v59.25,70.5 | R17.1 66.15,23.5 v65,23.5 63.85,23.5 R18.1
  Bottom 0.2: U7.3 61,17.75 60.25,17 v58.25,17 58.25,16.65 R21.1
  Bottom 0.3: M1:C9.2 49.85,54 v50,54 | M1:C1.2 47.75,65.35 v47.75,66.5 47.75,67.4 M1:C2.2 | v13.75,60 12.33,60 M1:U4.4 | M1:U3.4 11.33,53 v13.75,53 | M1:U2.4 11.8,46.98 12.83,48 v13.75,48 | M2:C2.2 M2:C10.2 44.75,43.55 v44.75,43 | M2:C9.2 49.15,36.6 v49.25,36.5 | IC1.10 31.38,95.12 v30.75,94.5 | U4.2 97.47,95.72 v97.25,95.5 95.4,95.5 C32.2 | U4.19 107.03,95.72 v107.25,95.5 109.1,95.5 C30.2 | U4.10 102.17,100.92 v102.25,101 102.33,100.92 U4.11 | v24.75,28.5 24.75,28.38 24.48,28.1 M2:U4.4 | v33.75,18.5 33.75,17.33 M2:U2.4 | M4:C9.2 97.25,72.65 v97.25,73 | v123.25,63.5 123.7,63.95 M4:U2.4 | v122.75,57.5 123.25,57.5 123.7,57.95 M4:U3.4 | v122.75,51 123.25,51 123.7,51.45 M4:U4.4 | M3:U2.4 110.37,27.5 v108.75,27.5 | M3:U3.4 105.87,23 v104.25,23 | v99.25,17.5 99.75,17 101.42,17 M3:U4.4 | C16.2 59.4,70.35 v59.25,70.5 | C14.2 62.6,66.75 63,67.15 v63,67.5 63,68.15 C20.2 | C18.2 64.75,68 v65.25,67.5 | J3.6 125.25,85.5 v124.75,85 | C15.2 72,67.75 71.75,67.5 v71.25,67.5 71.25,68.4 C19.2 | C21.2 v75.75,70 | C17.2 68.6,68.5 v67.25,68.5 | C9.2 59.6,54.65 v59.25,55 | C4.2 70.75,57.5 v71.25,58 72.4,58 C10.2 | C5.2 74.1,56.35 v74.25,56.5 75.1,56.5 C8.2 | C22.2 71.35,80.44 X1.2 72.25,80.25 v73.25,81.25 | IC1.17 IC1.16 26.8,93.15 C23.2 25.75,93.15 v25.75,93.75 | C49.2 63.65,37.6 v63.25,38.25 | v71.25,38.25 71.25,36.35 C47.2 | U12.2 68.25,26.5 v67.75,26 | U11.2 v72,28 72.25,28 73.35,26.9 R14.1 | U13.2 64.5,27.69 65,27.19 v65,26 | M2:U3.4 28.75,22.33 v28.75,23.5 | C48.2 67.4,37.9 v67.75,38.25 | R15.1 64.75,13.9 v64.75,13.5 | C13.2 v71.5,65.5 | M1:U4.6 15.92,58.33 14.25,60 v13.75,60 | M1:U3.6 16.63,52.33 15.96,53 v13.75,53 | M1:U2.6 15.92,46.33 15.25,47 15.25,47.5 14.75,48 v13.75,48